# Altium project DXES-101B.PrjPcb
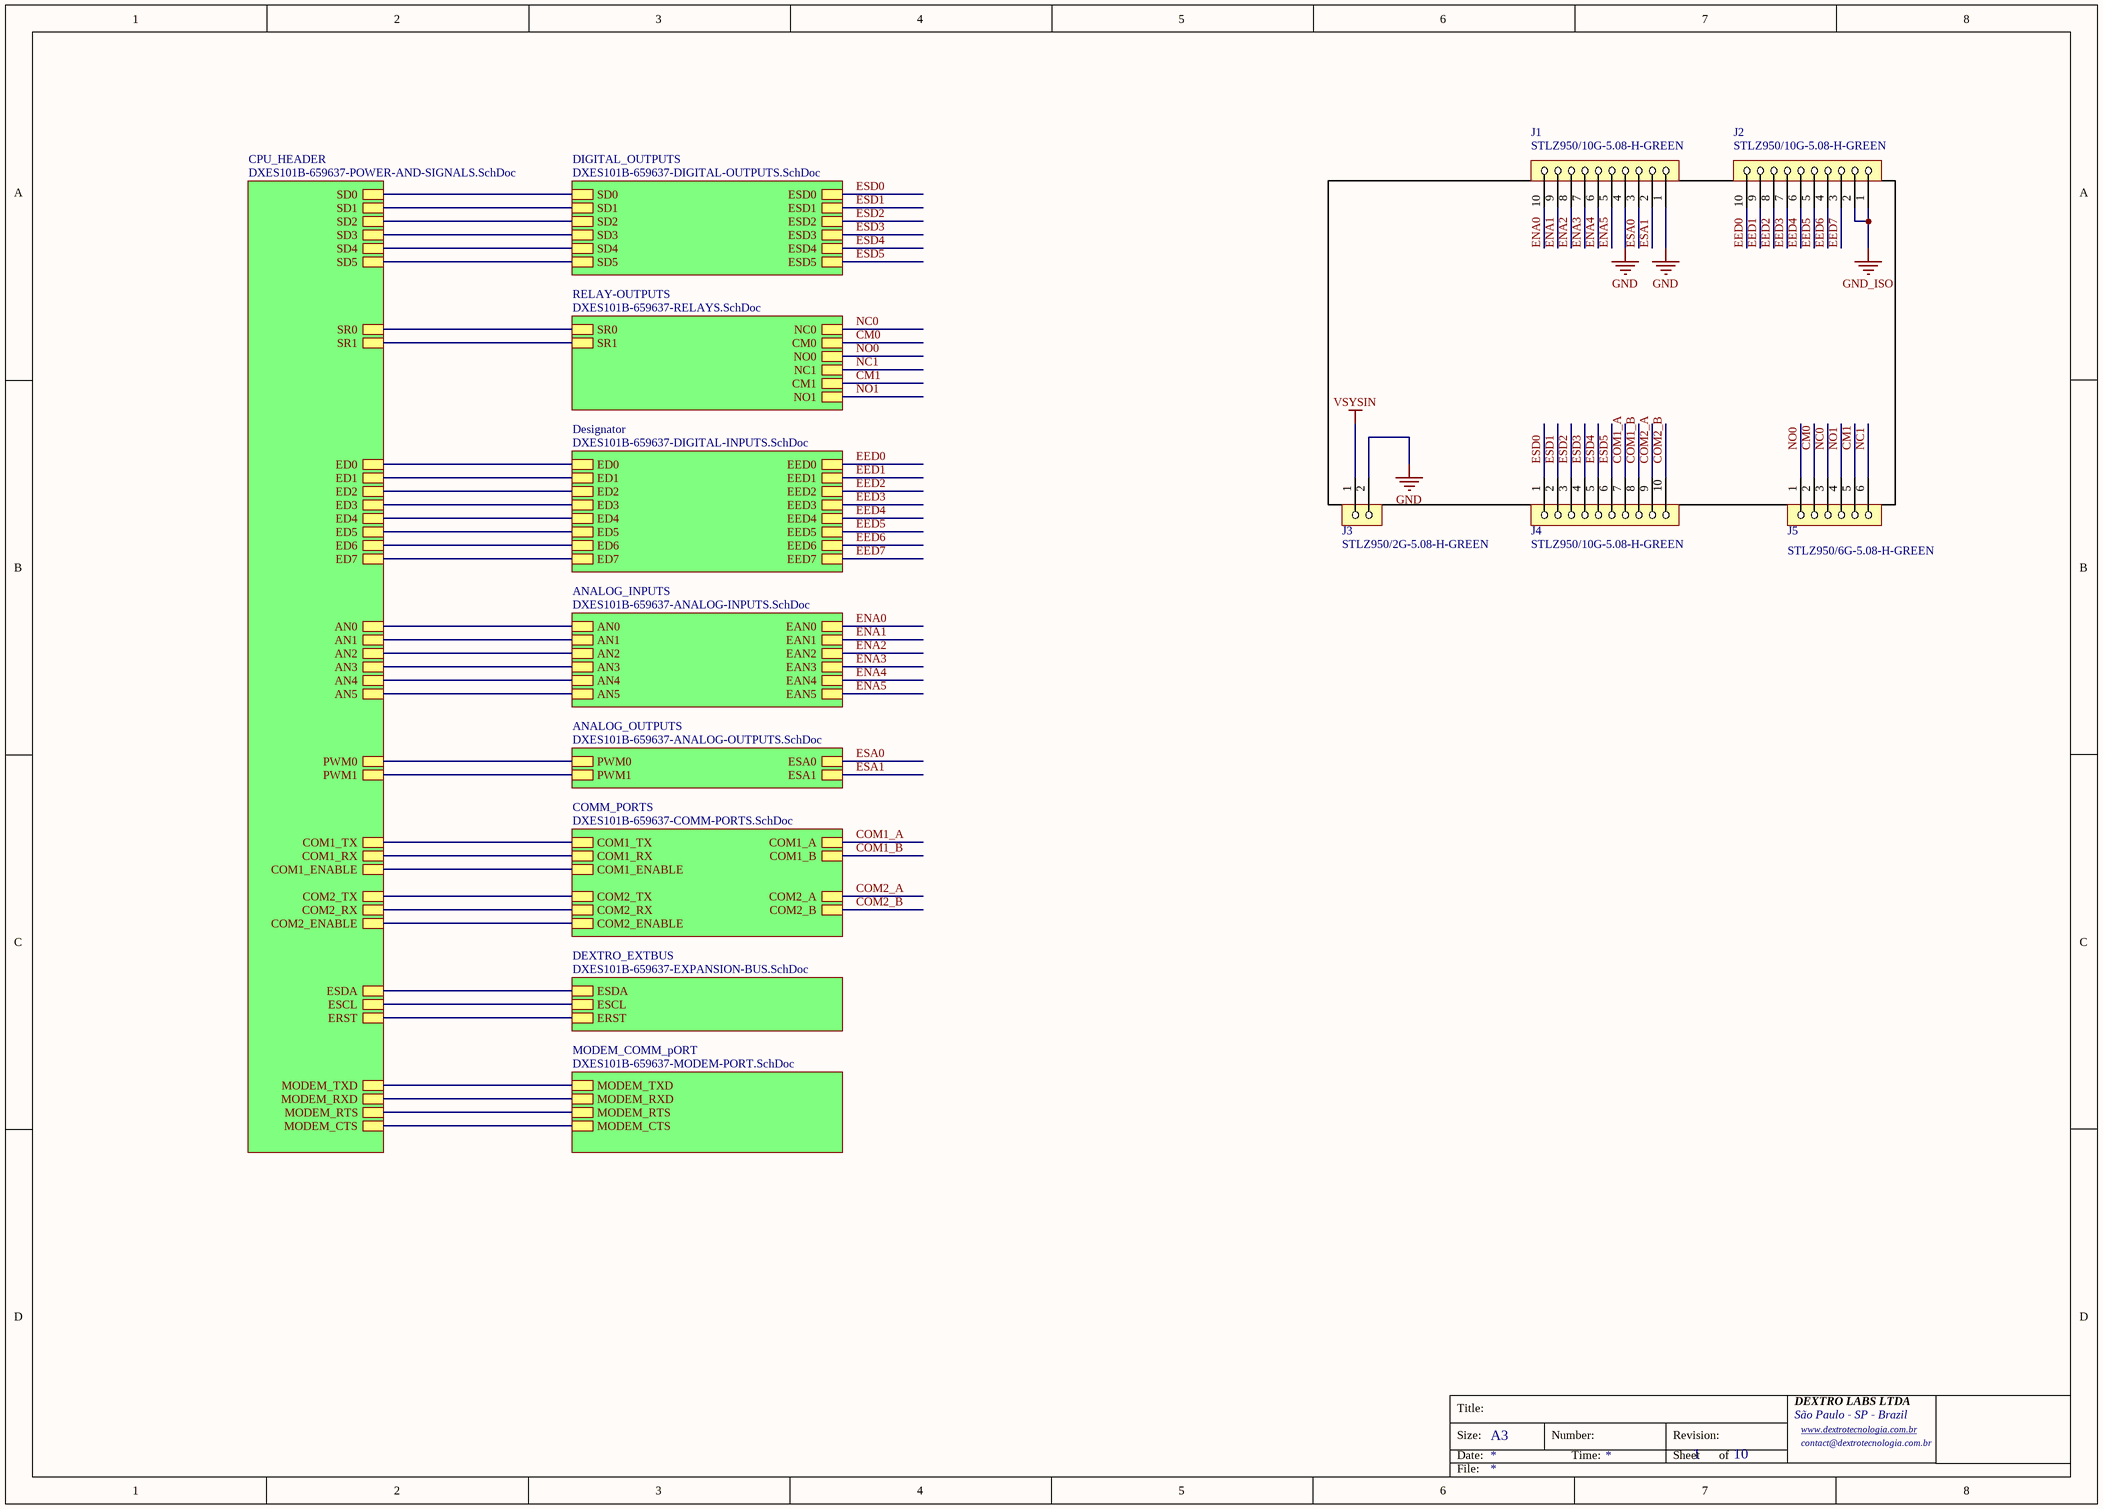
[diagram p0: DXES101B-659637-GENERAL.SchDoc]
10 sheets, 290 parts. Net scope: hierarchical (ports join the sheet entries above them; power ports are global).
Board file: DXES101B-659637.PcbDoc
Sheets:
  DXES101B-659637-GENERAL.SchDoc
    CPU_HEADER = DXES101B-659637-POWER-AND-SIGNALS.SchDoc
    DIGITAL_OUTPUTS = DXES101B-659637-DIGITAL-OUTPUTS.SchDoc
    RELAY-OUTPUTS = DXES101B-659637-RELAYS.SchDoc
    Designator = DXES101B-659637-DIGITAL-INPUTS.SchDoc
    ANALOG_INPUTS = DXES101B-659637-ANALOG-INPUTS.SchDoc
    ANALOG_OUTPUTS = DXES101B-659637-ANALOG-OUTPUTS.SchDoc
    COMM_PORTS = DXES101B-659637-COMM-PORTS.SchDoc
    DEXTRO_EXTBUS = DXES101B-659637-EXPANSION-BUS.SchDoc
    MODEM_COMM_pORT = DXES101B-659637-MODEM-PORT.SchDoc

## Sheet DXES101B-659637-GENERAL.SchDoc
size A3; Organization: Altium Limited; Address1: 3 Minna Close; Address2: Belrose; Address3: NSW 2085; Address4: Australia; SheetNumber: 1; SheetTotal: 10

### Parts
J1  STLZ950/10G-5.08-H-GREEN  [STLZ950-10G-H]
J2  STLZ950/10G-5.08-H-GREEN  [STLZ950-10G-H]
J3  STLZ950/2G-5.08-H-GREEN  [STLZ950-02G-H]
J4  STLZ950/10G-5.08-H-GREEN  [STLZ950-10G-H]
J5  STLZ950/6G-5.08-H-GREEN  [STLZ950-06G-H]

### Sub-sheets
ANALOG_INPUTS = DXES101B-659637-ANALOG-INPUTS.SchDoc: AN0, AN1, AN2, AN3, EAN0, EAN1, EAN2, EAN3, EAN4, EAN5, AN4, AN5
ANALOG_OUTPUTS = DXES101B-659637-ANALOG-OUTPUTS.SchDoc: PWM0, PWM1, ESA0, ESA1
COMM_PORTS = DXES101B-659637-COMM-PORTS.SchDoc: COM1_TX, COM1_RX, COM1_ENABLE, COM2_TX, COM2_RX, COM2_ENABLE, COM1_A, COM1_B, COM2_A, COM2_B
CPU_HEADER = DXES101B-659637-POWER-AND-SIGNALS.SchDoc: SD0, SD1, SD2, SD3, SD4, SD5, SR0, SR1, ED0, ED1, ED2, ED3, ED4, ED5, ED6, ED7, AN0, AN1, AN2, AN3, PWM0, PWM1, COM1_TX, COM1_RX, COM1_ENABLE, COM2_TX, COM2_RX, COM2_ENABLE, ESDA, ESCL, ERST, MODEM_TXD, MODEM_RXD, MODEM_RTS, MODEM_CTS, AN4, AN5
Designator = DXES101B-659637-DIGITAL-INPUTS.SchDoc: ED0, ED1, ED2, ED3, ED4, ED5, ED6, ED7, EED0, EED1, EED2, EED3, EED4, EED6, EED5, EED7
DEXTRO_EXTBUS = DXES101B-659637-EXPANSION-BUS.SchDoc: ESDA, ESCL, ERST
DIGITAL_OUTPUTS = DXES101B-659637-DIGITAL-OUTPUTS.SchDoc: SD0, SD1, SD2, SD3, SD4, SD5, ESD0, ESD1, ESD2, ESD3, ESD4, ESD5
MODEM_COMM_pORT = DXES101B-659637-MODEM-PORT.SchDoc: MODEM_TXD, MODEM_RXD, MODEM_RTS, MODEM_CTS
RELAY-OUTPUTS = DXES101B-659637-RELAYS.SchDoc: SR0, SR1, NC0, CM0, NO0, NC1, CM1, NO1

### Nets
GND: J1.1 J1.4 J3.2
GND_ISO: J2.1 J2.2
VSYSIN: J3.1
CM0: J5.2 ; sheet RELAY-OUTPUTS/CM0
CM1: J5.5 ; sheet RELAY-OUTPUTS/CM1
COM1_A: J4.7 ; sheet COMM_PORTS/COM1_A
COM1_B: J4.8 ; sheet COMM_PORTS/COM1_B
COM2_A: J4.9 ; sheet COMM_PORTS/COM2_A
COM2_B: J4.10 ; sheet COMM_PORTS/COM2_B
CTS: sheet CPU_HEADER/MODEM_CTS, sheet MODEM_COMM_pORT/MODEM_CTS
EED0: J2.10 ; sheet Designator/EED0
EED1: J2.9 ; sheet Designator/EED1
EED2: J2.8 ; sheet Designator/EED2
EED3: J2.7 ; sheet Designator/EED3
EED4: J2.6 ; sheet Designator/EED4
EED5: J2.5 ; sheet Designator/EED5
EED6: J2.4 ; sheet Designator/EED6
EED7: J2.3 ; sheet Designator/EED7
ENA0: J1.10 ; sheet ANALOG_INPUTS/EAN0
ENA1: J1.9 ; sheet ANALOG_INPUTS/EAN1
ENA2: J1.8 ; sheet ANALOG_INPUTS/EAN2
ENA3: J1.7 ; sheet ANALOG_INPUTS/EAN3
ENA4: J1.6 ; sheet ANALOG_INPUTS/EAN4
ENA5: J1.5 ; sheet ANALOG_INPUTS/EAN5
ESA0: J1.3 ; sheet ANALOG_OUTPUTS/ESA0
ESA1: J1.2 ; sheet ANALOG_OUTPUTS/ESA1
ESD0: J4.1 ; sheet DIGITAL_OUTPUTS/ESD0
ESD1: J4.2 ; sheet DIGITAL_OUTPUTS/ESD1
ESD2: J4.3 ; sheet DIGITAL_OUTPUTS/ESD2
ESD3: J4.4 ; sheet DIGITAL_OUTPUTS/ESD3
ESD4: J4.5 ; sheet DIGITAL_OUTPUTS/ESD4
ESD5: J4.6 ; sheet DIGITAL_OUTPUTS/ESD5
NC0: J5.3 ; sheet RELAY-OUTPUTS/NC0
NC1: J5.6 ; sheet RELAY-OUTPUTS/NC1
NO0: J5.1 ; sheet RELAY-OUTPUTS/NO0
NO1: J5.4 ; sheet RELAY-OUTPUTS/NO1
RTS: sheet CPU_HEADER/MODEM_RTS, sheet MODEM_COMM_pORT/MODEM_RTS
RX2: sheet CPU_HEADER/MODEM_RXD, sheet MODEM_COMM_pORT/MODEM_RXD
TX2: sheet CPU_HEADER/MODEM_TXD, sheet MODEM_COMM_pORT/MODEM_TXD
NetC20_2: sheet CPU_HEADER/AN1, sheet ANALOG_INPUTS/AN1
NetC22_2: sheet CPU_HEADER/AN2, sheet ANALOG_INPUTS/AN2
NetC32_2: sheet CPU_HEADER/AN0, sheet ANALOG_INPUTS/AN0
NetC34_2: sheet CPU_HEADER/AN3, sheet ANALOG_INPUTS/AN3
NetC36_2: sheet CPU_HEADER/AN4, sheet ANALOG_INPUTS/AN4
NetC38_2: sheet CPU_HEADER/AN5, sheet ANALOG_INPUTS/AN5
NetJ6_3: sheet CPU_HEADER/ESDA, sheet DEXTRO_EXTBUS/ESDA
NetJ6_4: sheet CPU_HEADER/ESCL, sheet DEXTRO_EXTBUS/ESCL
NetJ6_5: sheet CPU_HEADER/ERST, sheet DEXTRO_EXTBUS/ERST
NetK1_1: sheet CPU_HEADER/ED0, sheet Designator/ED0
NetK1_2: sheet CPU_HEADER/ED1, sheet Designator/ED1
NetK1_3: sheet CPU_HEADER/ED2, sheet Designator/ED2
NetK1_4: sheet CPU_HEADER/ED3, sheet Designator/ED3
NetK1_5: sheet CPU_HEADER/ED4, sheet Designator/ED4
NetK1_6: sheet CPU_HEADER/ED5, sheet Designator/ED5
NetK1_7: sheet CPU_HEADER/ED6, sheet Designator/ED6
NetK1_8: sheet CPU_HEADER/ED7, sheet Designator/ED7
NetK1_15: sheet CPU_HEADER/SR0, sheet RELAY-OUTPUTS/SR0
NetK1_16: sheet CPU_HEADER/SR1, sheet RELAY-OUTPUTS/SR1
NetK2_9: sheet CPU_HEADER/PWM1, sheet ANALOG_OUTPUTS/PWM1
NetK2_10: sheet CPU_HEADER/PWM0, sheet ANALOG_OUTPUTS/PWM0
NetK3_1: sheet CPU_HEADER/COM1_TX, sheet COMM_PORTS/COM1_TX
NetK3_2: sheet CPU_HEADER/COM1_RX, sheet COMM_PORTS/COM1_RX
NetK3_3: sheet CPU_HEADER/COM1_ENABLE, sheet COMM_PORTS/COM1_ENABLE
NetK3_4: sheet CPU_HEADER/COM2_ENABLE, sheet COMM_PORTS/COM2_ENABLE
NetK3_5: sheet CPU_HEADER/COM2_TX, sheet COMM_PORTS/COM2_TX
NetK3_6: sheet CPU_HEADER/COM2_RX, sheet COMM_PORTS/COM2_RX
NetK3_9: sheet CPU_HEADER/SD0, sheet DIGITAL_OUTPUTS/SD0
NetK3_10: sheet CPU_HEADER/SD1, sheet DIGITAL_OUTPUTS/SD1
NetK3_11: sheet CPU_HEADER/SD2, sheet DIGITAL_OUTPUTS/SD2
NetK3_12: sheet CPU_HEADER/SD3, sheet DIGITAL_OUTPUTS/SD3
NetK3_13: sheet CPU_HEADER/SD4, sheet DIGITAL_OUTPUTS/SD4
NetK3_14: sheet CPU_HEADER/SD5, sheet DIGITAL_OUTPUTS/SD5

### Notes on the sheet
- Title:
- Size:
- Date:
- A3
- Number:
- Time:
- Revision:
- Sheet
- of
- DEXTRO LABS LTDA
- São Paulo - SP - Brazil
- www.dextrotecnologia.com.br <http://www.dextrotecnologia.com.br>
- contact@dextrotecnologia.com.br
- File:

### Library data of the parts
J1 J2 J4 = STLZ950/10G-5.08-H-GREEN: CONECTOR PHOENIX MECANO 10 VIAS PASSO 5,08mm VERDE 90º
J3 = STLZ950/2G-5.08-H-GREEN: CONECTOR PHOENIX MECANO 2 VIAS PASSO 5,08mm VERDE 90º
J5 = STLZ950/6G-5.08-H-GREEN: CONECTOR PHOENIX MECANO 6 VIAS PASSO 5,08mm VERDE 90º

## Sheet DXES101B-659637-POWER-AND-SIGNALS.SchDoc
size A3; Organization: Altium Limited; Address1: 3 Minna Close; Address2: Belrose; Address3: NSW 2085; Address4: Australia; SheetNumber: 2; SheetTotal: 10
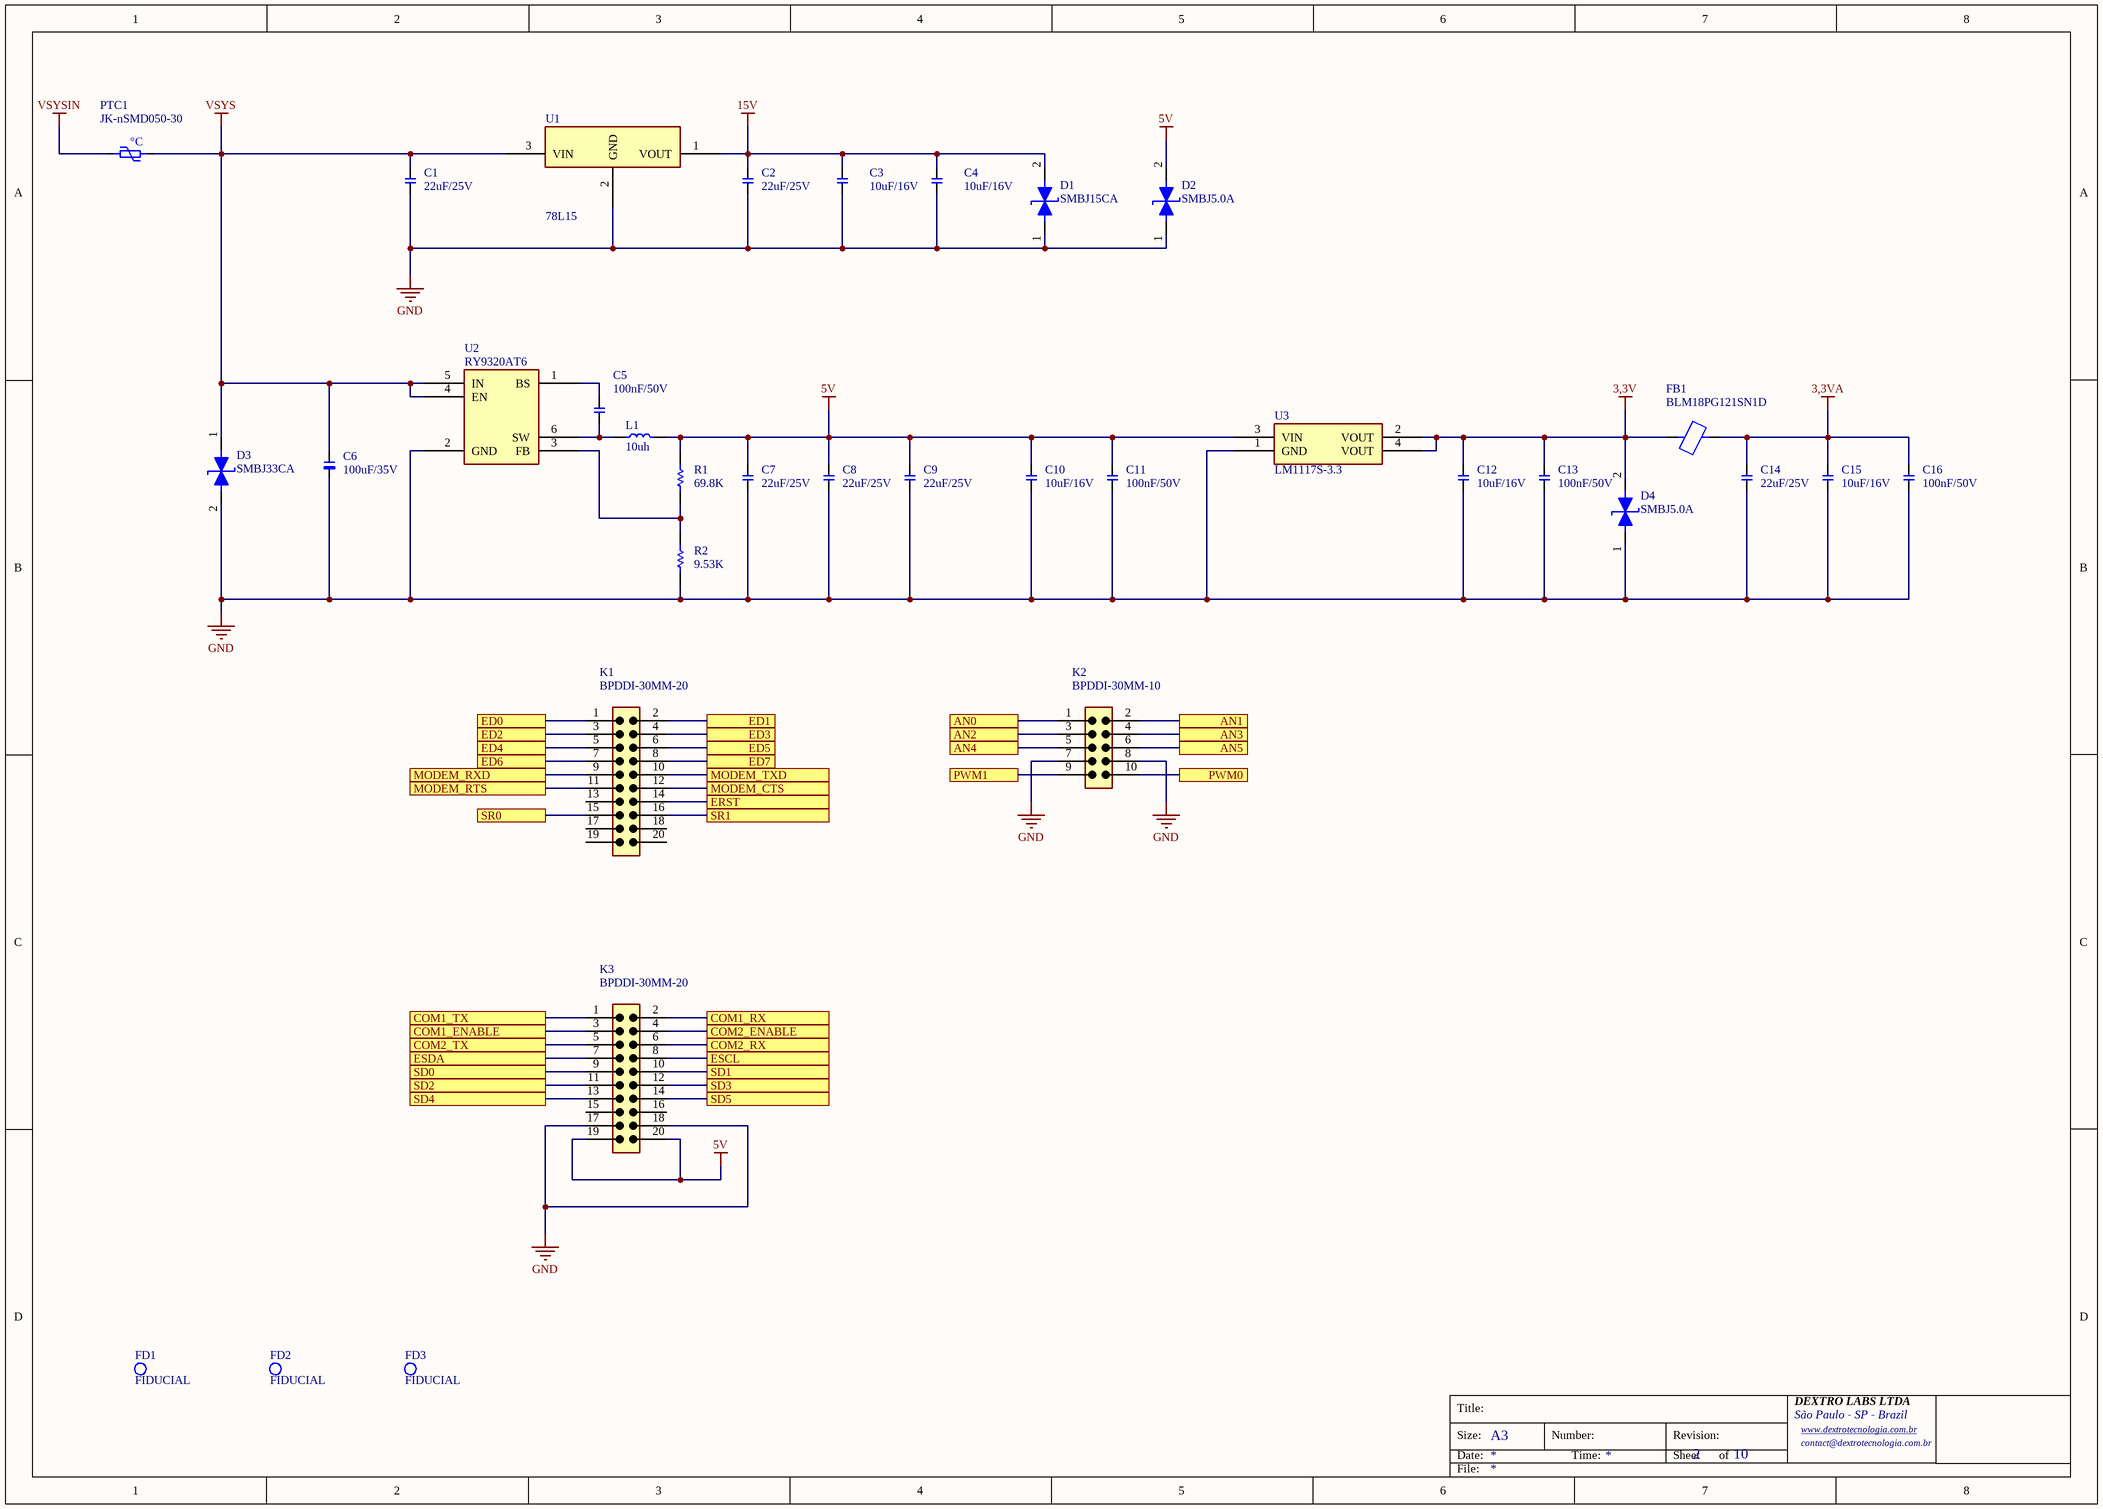
[diagram p1: DXES101B-659637-POWER-AND-SIGNALS.SchDoc]

### Parts
C1  22uF/25V  [CAP-1206]
C2  22uF/25V  [CAP-1206]
C3  10uF/16V  [CAP-0603]
C4  10uF/16V  [CAP-0603]
C5  100nF/50V  [CAP-0603]
C6  100uF/35V  [CAP-TH_BD6.3-P2.50-D1.0-FD]
C7  22uF/25V  [CAP-1206]
C8  22uF/25V  [CAP-1206]
C9  22uF/25V  [CAP-1206]
C10  10uF/16V  [CAP-0603]
C11  100nF/50V  [CAP-0603]
C12  10uF/16V  [CAP-0603]
C13  100nF/50V  [CAP-0603]
C14  22uF/25V  [CAP-1206]
C15  10uF/16V  [CAP-0603]
C16  100nF/50V  [CAP-0603]
D1  SMBJ15CA  [DO214-AA]
D2  SMBJ5.0A  [DO214-AA]
D3  SMBJ33CA  [DO214-AA]
D4  SMBJ5.0A  [DO214-AA]
FB1  BLM18PG121SN1D  [RES-0603]
FD1  FIDUCIAL  [FIDUCIAL]
FD2  FIDUCIAL  [FIDUCIAL]
FD3  FIDUCIAL  [FIDUCIAL]
K1  BPDDI-30MM-20  [BPDDI-30MM-20]
K2  BPDDI-30MM-10  [BPDDI-30MM-10]
K3  BPDDI-30MM-20  [BPDDI-30MM-20]
L1  10uh  [IND-SMD_2P-L5.0-W5.0]
PTC1  JK-nSMD050-30  [PTC-1206]
R1  69.8K  [RES-0603]
R2  9.53K  [RES-0603]
U1  78L15  [SOT-89-3_L4.5-W2.5-P1.50-LS4.1-BR]
U2  RY9320AT6  [SOT23-6]
U3  LM1117S-3.3  [SOT-223-3_L6.7-W3.7-P2.30-LS7.0-BR_2]

### Ports
AN0 (see DXES101B-659637-GENERAL[2B], DXES101B-659637-ANALOG-INPUTS[4A]), AN1 (see DXES101B-659637-GENERAL[2B], DXES101B-659637-ANALOG-INPUTS[8A]), AN2 (see DXES101B-659637-GENERAL[2B], DXES101B-659637-ANALOG-INPUTS[4B]), AN3 (see DXES101B-659637-GENERAL[2B], DXES101B-659637-ANALOG-INPUTS[8B]), AN4 (see DXES101B-659637-GENERAL[2B], DXES101B-659637-ANALOG-INPUTS[4C]), AN5 (see DXES101B-659637-GENERAL[2B], DXES101B-659637-ANALOG-INPUTS[8C]), COM1_ENABLE (see DXES101B-659637-GENERAL[2C], DXES101B-659637-COMM-PORTS[3A]), COM1_RX (see DXES101B-659637-GENERAL[2C], DXES101B-659637-COMM-PORTS[3A]), COM1_TX (see DXES101B-659637-GENERAL[2C], DXES101B-659637-COMM-PORTS[3A]), COM2_ENABLE (see DXES101B-659637-GENERAL[2C], DXES101B-659637-COMM-PORTS[3B]), COM2_RX (see DXES101B-659637-GENERAL[2C], DXES101B-659637-COMM-PORTS[3B]), COM2_TX (see DXES101B-659637-GENERAL[2C], DXES101B-659637-COMM-PORTS[3B]), ED0 (see DXES101B-659637-GENERAL[2B], DXES101B-659637-DIGITAL-INPUTS[4A]), ED1 (see DXES101B-659637-GENERAL[2B], DXES101B-659637-DIGITAL-INPUTS[7A]), ED2 (see DXES101B-659637-GENERAL[2B], DXES101B-659637-DIGITAL-INPUTS[4B]), ED3 (see DXES101B-659637-GENERAL[2B], DXES101B-659637-DIGITAL-INPUTS[7B]), ED4 (see DXES101B-659637-GENERAL[2B], DXES101B-659637-DIGITAL-INPUTS[4B]), ED5 (see DXES101B-659637-GENERAL[2B], DXES101B-659637-DIGITAL-INPUTS[7B]), ED6 (see DXES101B-659637-GENERAL[2B], DXES101B-659637-DIGITAL-INPUTS[4C]), ED7 (see DXES101B-659637-GENERAL[2B], DXES101B-659637-DIGITAL-INPUTS[7C]), ERST (see DXES101B-659637-GENERAL[2C], DXES101B-659637-EXPANSION-BUS[4B]), ESCL (see DXES101B-659637-GENERAL[2C], DXES101B-659637-EXPANSION-BUS[4B]), ESDA (see DXES101B-659637-GENERAL[2C], DXES101B-659637-EXPANSION-BUS[4B]), MODEM_CTS (see DXES101B-659637-GENERAL[2C], DXES101B-659637-MODEM-PORT[4B]), MODEM_RTS (see DXES101B-659637-GENERAL[2C], DXES101B-659637-MODEM-PORT[4B]), MODEM_RXD (see DXES101B-659637-GENERAL[2C], DXES101B-659637-MODEM-PORT[4B]), MODEM_TXD (see DXES101B-659637-GENERAL[2C], DXES101B-659637-MODEM-PORT[4B]), PWM0 (see DXES101B-659637-GENERAL[2C], DXES101B-659637-ANALOG-OUTPUTS[2A]), PWM1 (see DXES101B-659637-GENERAL[2C], DXES101B-659637-ANALOG-OUTPUTS[2C]), SD0 (see DXES101B-659637-GENERAL[2A], DXES101B-659637-DIGITAL-OUTPUTS[1B]), SD1 (see DXES101B-659637-GENERAL[2A], DXES101B-659637-DIGITAL-OUTPUTS[3B]), SD2 (see DXES101B-659637-GENERAL[2A], DXES101B-659637-DIGITAL-OUTPUTS[6B]), SD3 (see DXES101B-659637-GENERAL[2A], DXES101B-659637-DIGITAL-OUTPUTS[1C]), SD4 (see DXES101B-659637-GENERAL[2A], DXES101B-659637-DIGITAL-OUTPUTS[3C]), SD5 (see DXES101B-659637-GENERAL[2A], DXES101B-659637-DIGITAL-OUTPUTS[6C]), SR0 (see DXES101B-659637-GENERAL[2A], DXES101B-659637-RELAYS[3B]), SR1 (see DXES101B-659637-GENERAL[2A], DXES101B-659637-RELAYS[3C])

### Nets
3,3V: C12.2 C13.2 D4.2(A2) FB1.1 U3.2(VOUT) U3.4(VOUT)
3,3VA: C14.2 C15.2 C16.2 FB1.2
5V: C7.2 C8.2 C9.2 C10.2 C11.2 D2.2(A2) K3.19 K3.20 L1.2 R1.2 U3.3(VIN)
15V: C2.2 C3.2 C4.2 D1.2(A2) U1.1(VOUT)
GND: C1.1 C2.1 C3.1 C4.1 C6.2 C7.1 C8.1 C9.1 C10.1 C11.1 C12.1 C13.1 C14.1 C15.1 C16.1 D1.1(A1) D2.1(A1) D3.2(A1) D4.1(A1) K2.7 K2.8 K3.17 K3.18 R2.1 U1.2(GND) U2.2(GND) U3.1(GND)
VSYS: C1.2 C6.1 D3.1(A2) PTC1.2 U1.3(VIN) U2.4(EN) U2.5(IN)
VSYSIN: PTC1.1
CTS: K1.12 ; port MODEM_CTS
RTS: K1.11 ; port MODEM_RTS
RX2: K1.9 ; port MODEM_RXD
TX2: K1.10 ; port MODEM_TXD
NetC5_1: C5.1 L1.1 U2.6(SW)
NetC5_2: C5.2 U2.1(BS)
NetC20_2: K2.2 ; port AN1
NetC22_2: K2.3 ; port AN2
NetC32_2: K2.1 ; port AN0
NetC34_2: K2.4 ; port AN3
NetC36_2: K2.5 ; port AN4
NetC38_2: K2.6 ; port AN5
NetJ6_3: K3.7 ; port ESDA
NetJ6_4: K3.8 ; port ESCL
NetJ6_5: K1.14 ; port ERST
NetK1_1: K1.1 ; port ED0
NetK1_2: K1.2 ; port ED1
NetK1_3: K1.3 ; port ED2
NetK1_4: K1.4 ; port ED3
NetK1_5: K1.5 ; port ED4
NetK1_6: K1.6 ; port ED5
NetK1_7: K1.7 ; port ED6
NetK1_8: K1.8 ; port ED7
NetK1_15: K1.15 ; port SR0
NetK1_16: K1.16 ; port SR1
NetK2_9: K2.9 ; port PWM1
NetK2_10: K2.10 ; port PWM0
NetK3_1: K3.1 ; port COM1_TX
NetK3_2: K3.2 ; port COM1_RX
NetK3_3: K3.3 ; port COM1_ENABLE
NetK3_4: K3.4 ; port COM2_ENABLE
NetK3_5: K3.5 ; port COM2_TX
NetK3_6: K3.6 ; port COM2_RX
NetK3_9: K3.9 ; port SD0
NetK3_10: K3.10 ; port SD1
NetK3_11: K3.11 ; port SD2
NetK3_12: K3.12 ; port SD3
NetK3_13: K3.13 ; port SD4
NetK3_14: K3.14 ; port SD5
NetR1_1: R1.1 R2.2 U2.3(FB)

Not connected (* = marked no-connect by the designer): K1 13 17 18 19 20; K3 15 16

### Notes on the sheet
- Title:
- Size:
- Date:
- A3
- Number:
- Time:
- Revision:
- Sheet
- of
- DEXTRO LABS LTDA
- São Paulo - SP - Brazil
- www.dextrotecnologia.com.br <http://www.dextrotecnologia.com.br>
- contact@dextrotecnologia.com.br
- File:
- (in symbol PTC-FUSE-30V-500mA-1206) °C

### Library data of the parts
C1 C2 C7-C9 C14 = CAP-22uF/25V-1206-X5R-MLCC: 25V 22uF X5R ±10% 1206 Multilayer Ceramic Capacitors MLCC - SMD/SMT ROHS; LCSC: C12891
C3 C4 C10 C12 C15 = CAP-10uF/16V-0603-X5R: 16V 10uF X5R ±20% 0603 Multilayer Ceramic Capacitors MLCC - SMD/SMT ROHS; LCSC: C92487
C5 C11 C13 C16 = CAP-100nF/50V-0603-X7R-MLCC: 50V 100nF X7R ±10% 0603 Multilayer Ceramic Capacitors MLCC - SMD/SMT ROHS; LCSC: C14663
C6 = CAP-100uF/35V-ELET-D10xL20mm_1: 100uF 35V Aluminum Electrolytic Capacitors Through Hole,D6.3xL11mm 2000hrs@105℃; LCSC: C109392
D1 = SMBJ15CA: 24.6A 600W@8/20us 24.4V 19.2V Bidirectional 15V SMB(DO-214AA) ESD and Surge Protection (TVS/ESD) ROHS; LCSC: C2760879
D2 D4 = SMBJ5.0A: 65.3A 600W 9.2V 6.4V Unidirectional 5V DO-214AA ESD and Surge Protection (TVS/ESD) ROHS; LCSC: C83333
D3 = SMBJ33CA: A 600W@8/20us 24.4V 33V Bidirectional 15V SMB(DO-214AA) ESD and Surge Protection (TVS/ESD) ROHS; LCSC: C3001986
FB1 = BLM18PG121SN1D: FERRITE BEAD 120Ω 0603 1LN; LCSC: C14709
K1 K3 = BPDDI-30MM-20: BARRA DE PINOS DUPLA 2,54mm 20 VIAS 180º DUPLO ISOLADOR PINO 30mm
K2 = BPDDI-30MM-10: BARRA DE PINOS DUPLA 2,54mm 10 VIAS 180º DUPLO ISOLADOR PINO 30mm
L1 = FIXED-INDUCTOR-SMD-10uH-5X5mm-2A-15mΩ_1: 2A 10uH ±20% Magnetic Shielded Inductor 2A SMD,5x5mm Fixed Inductors RoHS; LCSC: C9389
PTC1 = PTC-FUSE-30V-500mA-1206: 30V 500mA 100A 1A 150mΩ 1206 PTC Resettable Fuses ROHS; LCSC: C720075
R1 = RES-69.8K-1%-100mW-0603_1: 100mW Thick Film Resistor 75V ±100ppm/℃ ±1% 69.8K 0603 Chip Resistor - Surface Mount ROHS; LCSC: C2907025
R2 = RES-9.53K-1%-100mW-0603: 100mW Thick Film Resistor 75V ±100ppm/℃ ±1% 9.53K 0603 Chip Resistor - Surface Mount ROHS; LCSC: C23127
U1 = 78L15: 3-Terminal Positive Voltage Regulator - SOT89; LCSC: C5309538
U2 = RY9320AT6: 500kHz Buck Adjustable 2A SOT-23-6 Voltage Regulators - DC DC Switching Regulators RoHS; LCSCC: C2962442
U3 = LM1117S-3.3: LCSC: C126027

## Sheet DXES101B-659637-DIGITAL-OUTPUTS.SchDoc: DXES100
size A3; Organization: Altium Limited; Address1: 3 Minna Close; Address2: Belrose; Address3: NSW 2085; Address4: Australia; SheetNumber: 3; SheetTotal: 10
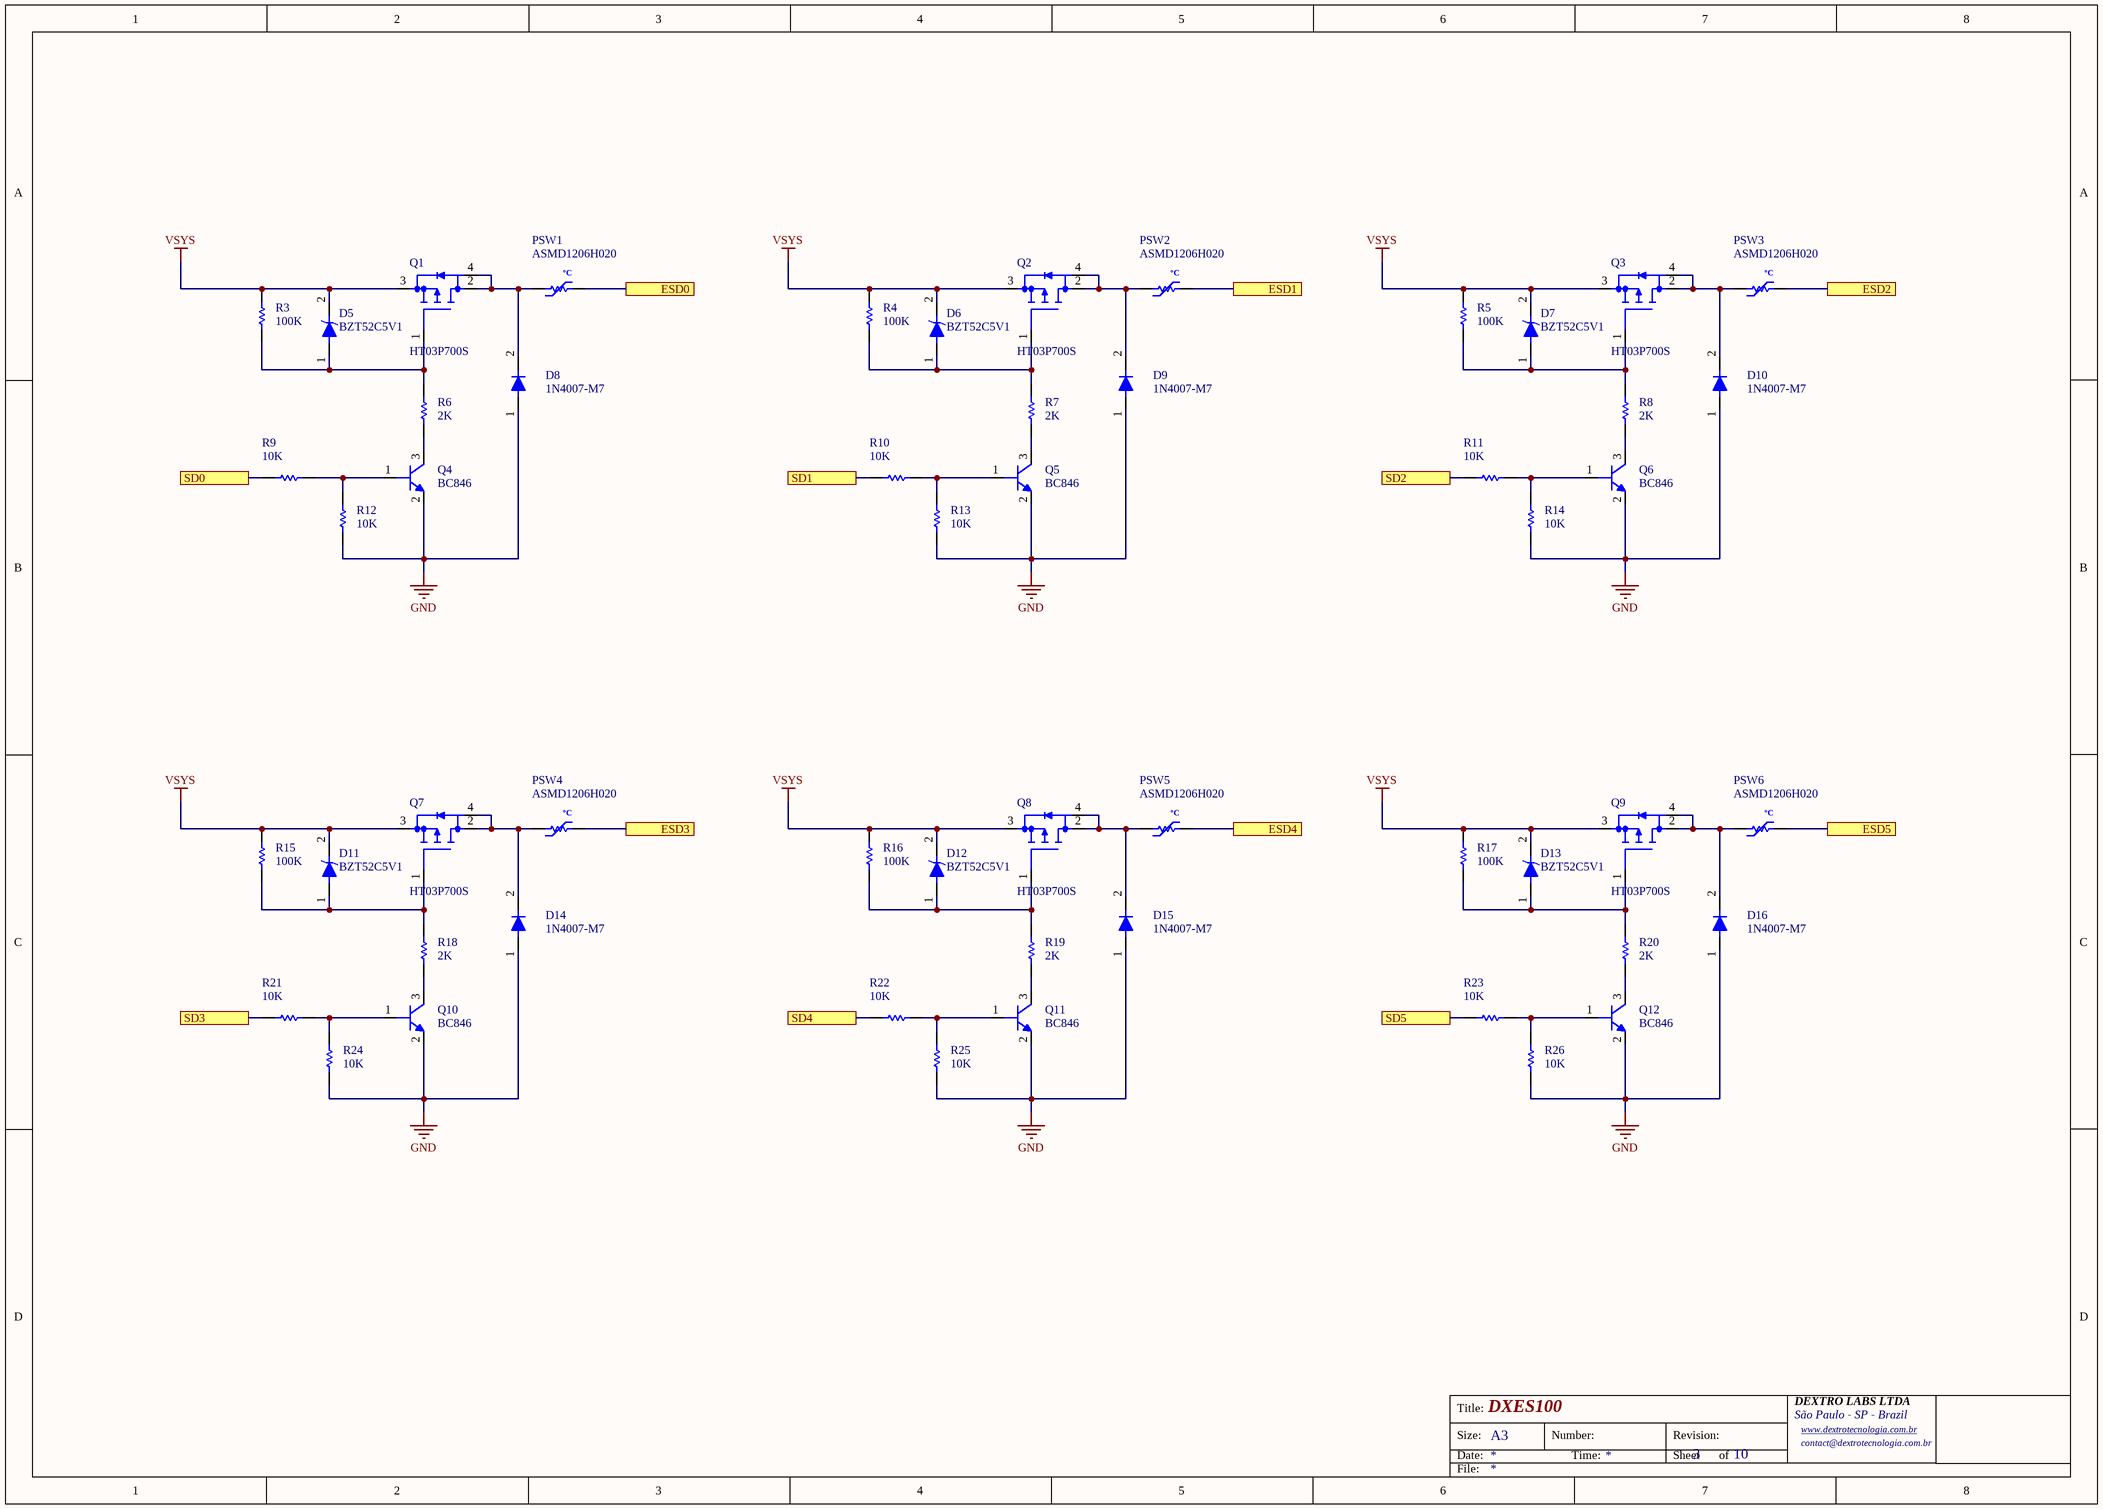
[diagram p2: DXES101B-659637-DIGITAL-OUTPUTS.SchDoc]

### Parts
D5  BZT52C5V1  [SOD123]
D6  BZT52C5V1  [SOD123]
D7  BZT52C5V1  [SOD123]
D8  1N4007-M7  [SMA]
D9  1N4007-M7  [SMA]
D10  1N4007-M7  [SMA]
D11  BZT52C5V1  [SOD123]
D12  BZT52C5V1  [SOD123]
D13  BZT52C5V1  [SOD123]
D14  1N4007-M7  [SMA]
D15  1N4007-M7  [SMA]
D16  1N4007-M7  [SMA]
PSW1  ASMD1206H020  [PTC-1206]
PSW2  ASMD1206H020  [PTC-1206]
PSW3  ASMD1206H020  [PTC-1206]
PSW4  ASMD1206H020  [PTC-1206]
PSW5  ASMD1206H020  [PTC-1206]
PSW6  ASMD1206H020  [PTC-1206]
Q1  HT03P700S  [SOT-223-3_L6.7-W3.7-P2.30-LS7.0-BR_2]
Q2  HT03P700S  [SOT-223-3_L6.7-W3.7-P2.30-LS7.0-BR_2]
Q3  HT03P700S  [SOT-223-3_L6.7-W3.7-P2.30-LS7.0-BR_2]
Q4  BC846  [SOT23-3]
Q5  BC846  [SOT23-3]
Q6  BC846  [SOT23-3]
Q7  HT03P700S  [SOT-223-3_L6.7-W3.7-P2.30-LS7.0-BR_2]
Q8  HT03P700S  [SOT-223-3_L6.7-W3.7-P2.30-LS7.0-BR_2]
Q9  HT03P700S  [SOT-223-3_L6.7-W3.7-P2.30-LS7.0-BR_2]
Q10  BC846  [SOT23-3]
Q11  BC846  [SOT23-3]
Q12  BC846  [SOT23-3]
R3  100K  [RES-0603]
R4  100K  [RES-0603]
R5  100K  [RES-0603]
R6  2K  [RES-1206]
R7  2K  [RES-1206]
R8  2K  [RES-1206]
R9  10K  [RES-0603]
R10  10K  [RES-0603]
R11  10K  [RES-0603]
R12  10K  [RES-0603]
R13  10K  [RES-0603]
R14  10K  [RES-0603]
R15  100K  [RES-0603]
R16  100K  [RES-0603]
R17  100K  [RES-0603]
R18  2K  [RES-1206]
R19  2K  [RES-1206]
R20  2K  [RES-1206]
R21  10K  [RES-0603]
R22  10K  [RES-0603]
R23  10K  [RES-0603]
R24  10K  [RES-0603]
R25  10K  [RES-0603]
R26  10K  [RES-0603]

### Ports
ESD0 (see DXES101B-659637-GENERAL[4A]), ESD1 (see DXES101B-659637-GENERAL[4A]), ESD2 (see DXES101B-659637-GENERAL[4A]), ESD3 (see DXES101B-659637-GENERAL[4A]), ESD4 (see DXES101B-659637-GENERAL[4A]), ESD5 (see DXES101B-659637-GENERAL[4A]), SD0 (see DXES101B-659637-GENERAL[3A], DXES101B-659637-POWER-AND-SIGNALS[2C]), SD1 (see DXES101B-659637-GENERAL[3A], DXES101B-659637-POWER-AND-SIGNALS[3C]), SD2 (see DXES101B-659637-GENERAL[3A], DXES101B-659637-POWER-AND-SIGNALS[2C]), SD3 (see DXES101B-659637-GENERAL[3A], DXES101B-659637-POWER-AND-SIGNALS[3C]), SD4 (see DXES101B-659637-GENERAL[3A], DXES101B-659637-POWER-AND-SIGNALS[2C]), SD5 (see DXES101B-659637-GENERAL[3A], DXES101B-659637-POWER-AND-SIGNALS[3C])

### Nets
GND: D8.1(A1) D9.1(A1) D10.1(A1) D14.1(A1) D15.1(A1) D16.1(A1) Q4.2 Q5.2 Q6.2 Q10.2 Q11.2 Q12.2 R12.1 R13.1 R14.1 R24.1 R25.1 R26.1
VSYS: D5.2(K) D6.2(K) D7.2(K) D11.2(K) D12.2(K) D13.2(K) Q1.3(S) Q2.3(S) Q3.3(S) Q7.3(S) Q8.3(S) Q9.3(S) R3.2 R4.2 R5.2 R15.2 R16.2 R17.2
ESD0: PSW1.2 ; port ESD0
ESD1: PSW2.2 ; port ESD1
ESD2: PSW3.2 ; port ESD2
ESD3: PSW4.2 ; port ESD3
ESD4: PSW5.2 ; port ESD4
ESD5: PSW6.2 ; port ESD5
NetD5_1: D5.1(A1) Q1.1(G]) R3.1 R6.2
NetD6_1: D6.1(A1) Q2.1(G]) R4.1 R7.2
NetD7_1: D7.1(A1) Q3.1(G]) R5.1 R8.2
NetD8_2: D8.2(K) PSW1.1 Q1.2(D) Q1.4(D)
NetD9_2: D9.2(K) PSW2.1 Q2.2(D) Q2.4(D)
NetD10_2: D10.2(K) PSW3.1 Q3.2(D) Q3.4(D)
NetD11_1: D11.1(A1) Q7.1(G]) R15.1 R18.2
NetD12_1: D12.1(A1) Q8.1(G]) R16.1 R19.2
NetD13_1: D13.1(A1) Q9.1(G]) R17.1 R20.2
NetD14_2: D14.2(K) PSW4.1 Q7.2(D) Q7.4(D)
NetD15_2: D15.2(K) PSW5.1 Q8.2(D) Q8.4(D)
NetD16_2: D16.2(K) PSW6.1 Q9.2(D) Q9.4(D)
NetK3_9: R9.2 ; port SD0
NetK3_10: R10.2 ; port SD1
NetK3_11: R11.2 ; port SD2
NetK3_12: R21.2 ; port SD3
NetK3_13: R22.2 ; port SD4
NetK3_14: R23.2 ; port SD5
NetQ4_1: Q4.1 R9.1 R12.2
NetQ4_3: Q4.3 R6.1
NetQ5_1: Q5.1 R10.1 R13.2
NetQ5_3: Q5.3 R7.1
NetQ6_1: Q6.1 R11.1 R14.2
NetQ6_3: Q6.3 R8.1
NetQ10_1: Q10.1 R21.1 R24.2
NetQ10_3: Q10.3 R18.1
NetQ11_1: Q11.1 R22.1 R25.2
NetQ11_3: Q11.3 R19.1
NetQ12_1: Q12.1 R23.1 R26.2
NetQ12_3: Q12.3 R20.1

### Notes on the sheet
- Title:
- Size:
- Date:
- A3
- Number:
- Time:
- Revision:
- Sheet
- of
- DEXTRO LABS LTDA
- São Paulo - SP - Brazil
- www.dextrotecnologia.com.br <http://www.dextrotecnologia.com.br>
- contact@dextrotecnologia.com.br
- File:
- (in symbol ASMD1206H020) ºC

### Library data of the parts
D5-D7 D11-D13 = BZT52C5V1: DIODE-ZENER-5V1-500mV
D8-D10 D14-D16 = 1N4007-M7: C20754788; LCSC: C20754788
PSW1-PSW6 = ASMD1206H020: PTC RESET FUSE 30V 200mA 1206
Q1-Q3 Q7-Q9 = HT03P700S: MOSFET P-CH 30V 6A SOT-223; LCSC: C49066900
Q4-Q6 Q10-Q12 = TRANSISTOR-BC846B,215-SOT23: 65V 200@10mA,5V 250mW 100mA NPN SOT-23 Bipolar (BJT) ROHS; LCSC: C87062
R3-R5 R15-R17 = RES-100K-1%-100mW-0603: 100mW Thick Film Resistor 75V ±100ppm/℃ ±1% 100kΩ 0603 Chip Resistor - Surface Mount ROHS; LCSC: C14675
R6-R8 R18-R20 = RES-2K-1%-250mW-1206: 250mW Thick Film Resistor 200V ±100ppm/℃ ±5% 2kΩ 1206 Chip Resistor - Surface Mount ROHS; LCSC: C2907466
R9-R14 R21-R26 = RES-10K-1%-100mW-0603: 100mW Thick Film Resistor 75V ±100ppm/℃ ±1% 10kΩ 0603 Chip Resistor - Surface Mount ROHS; LCSC: C98220

## Sheet DXES101B-659637-RELAYS.SchDoc
size A3; Organization: Altium Limited; Address1: 3 Minna Close; Address2: Belrose; Address3: NSW 2085; Address4: Australia; SheetNumber: 4; SheetTotal: 10
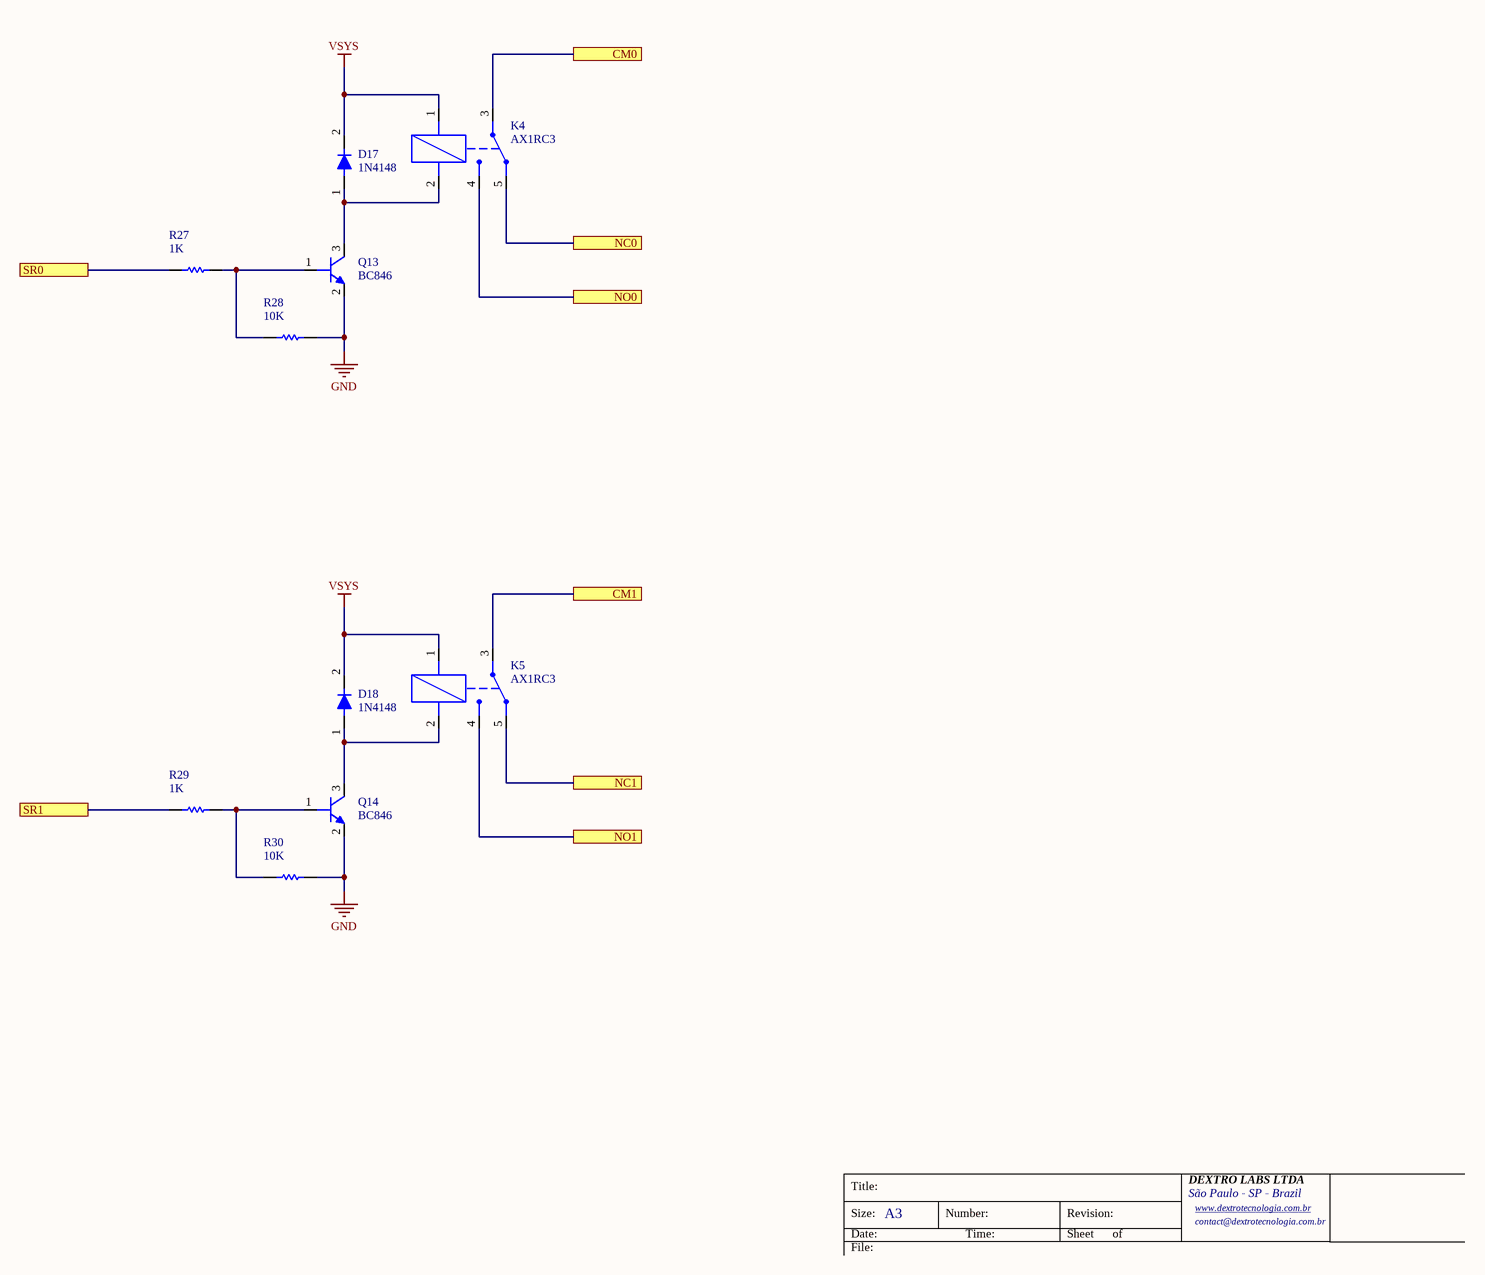
[diagram p3: DXES101B-659637-RELAYS.SchDoc]

### Parts
D17  1N4148  [SOD123]
D18  1N4148  [SOD123]
K4  AX1RC3  [AX1RCX]
K5  AX1RC3  [AX1RCX]
Q13  BC846  [SOT23-3]
Q14  BC846  [SOT23-3]
R27  1K  [RES-0603]
R28  10K  [RES-0603]
R29  1K  [RES-0603]
R30  10K  [RES-0603]

### Ports
CM0 (see DXES101B-659637-GENERAL[4A]), CM1 (see DXES101B-659637-GENERAL[4B]), NC0 (see DXES101B-659637-GENERAL[4A]), NC1 (see DXES101B-659637-GENERAL[4A]), NO0 (see DXES101B-659637-GENERAL[4A]), NO1 (see DXES101B-659637-GENERAL[4B]), SR0 (see DXES101B-659637-GENERAL[3A], DXES101B-659637-POWER-AND-SIGNALS[2C]), SR1 (see DXES101B-659637-GENERAL[3A], DXES101B-659637-POWER-AND-SIGNALS[3C])

### Nets
GND: Q13.2 Q14.2 R28.2 R30.2
VSYS: D17.2(K) D18.2(K) K4.1 K5.1
CM0: K4.3 ; port CM0
CM1: K5.3 ; port CM1
NC0: K4.5 ; port NC0
NC1: K5.5 ; port NC1
NO0: K4.4 ; port NO0
NO1: K5.4 ; port NO1
NetD17_1: D17.1(A1) K4.2 Q13.3
NetD18_1: D18.1(A1) K5.2 Q14.3
NetK1_15: R27.1 ; port SR0
NetK1_16: R29.1 ; port SR1
NetQ13_1: Q13.1 R27.2 R28.1
NetQ14_1: Q14.1 R29.2 R30.1

### Notes on the sheet
- Title:
- Size:
- Date:
- A3
- Number:
- Time:
- Revision:
- Sheet
- of
- DEXTRO LABS LTDA
- São Paulo - SP - Brazil
- www.dextrotecnologia.com.br <http://www.dextrotecnologia.com.br>
- contact@dextrotecnologia.com.br
- File:

### Library data of the parts
D17 D18 = 1N4148: 1A 4ns 75V Independent 1V@50mA 150mA SOD-123 Single Diodes RoHS
K4 K5 = AX1RC3: RELÉ-METALTEX-BOBINA 24V-15A-SPDT
Q13 Q14 = TRANSISTOR-BC846B,215-SOT23: as Q4 on sheet DXES101B-659637-DIGITAL-OUTPUTS; LCSC: C87062
R27 R29 = RES-1K-1%-100mW-0603: 100mW Thick Film Resistor 75V ±100ppm/℃ ±1% 1kΩ 0603 Chip Resistor - Surface Mount ROHS; LCSC: C22548
R28 R30 = RES-10K-1%-100mW-0603: as R9 on sheet DXES101B-659637-DIGITAL-OUTPUTS; LCSC: C98220

## Sheet DXES101B-659637-DIGITAL-INPUTS.SchDoc
size A3; Organization: Altium Limited; Address1: 3 Minna Close; Address2: Belrose; Address3: NSW 2085; Address4: Australia; SheetNumber: 5; SheetTotal: 10
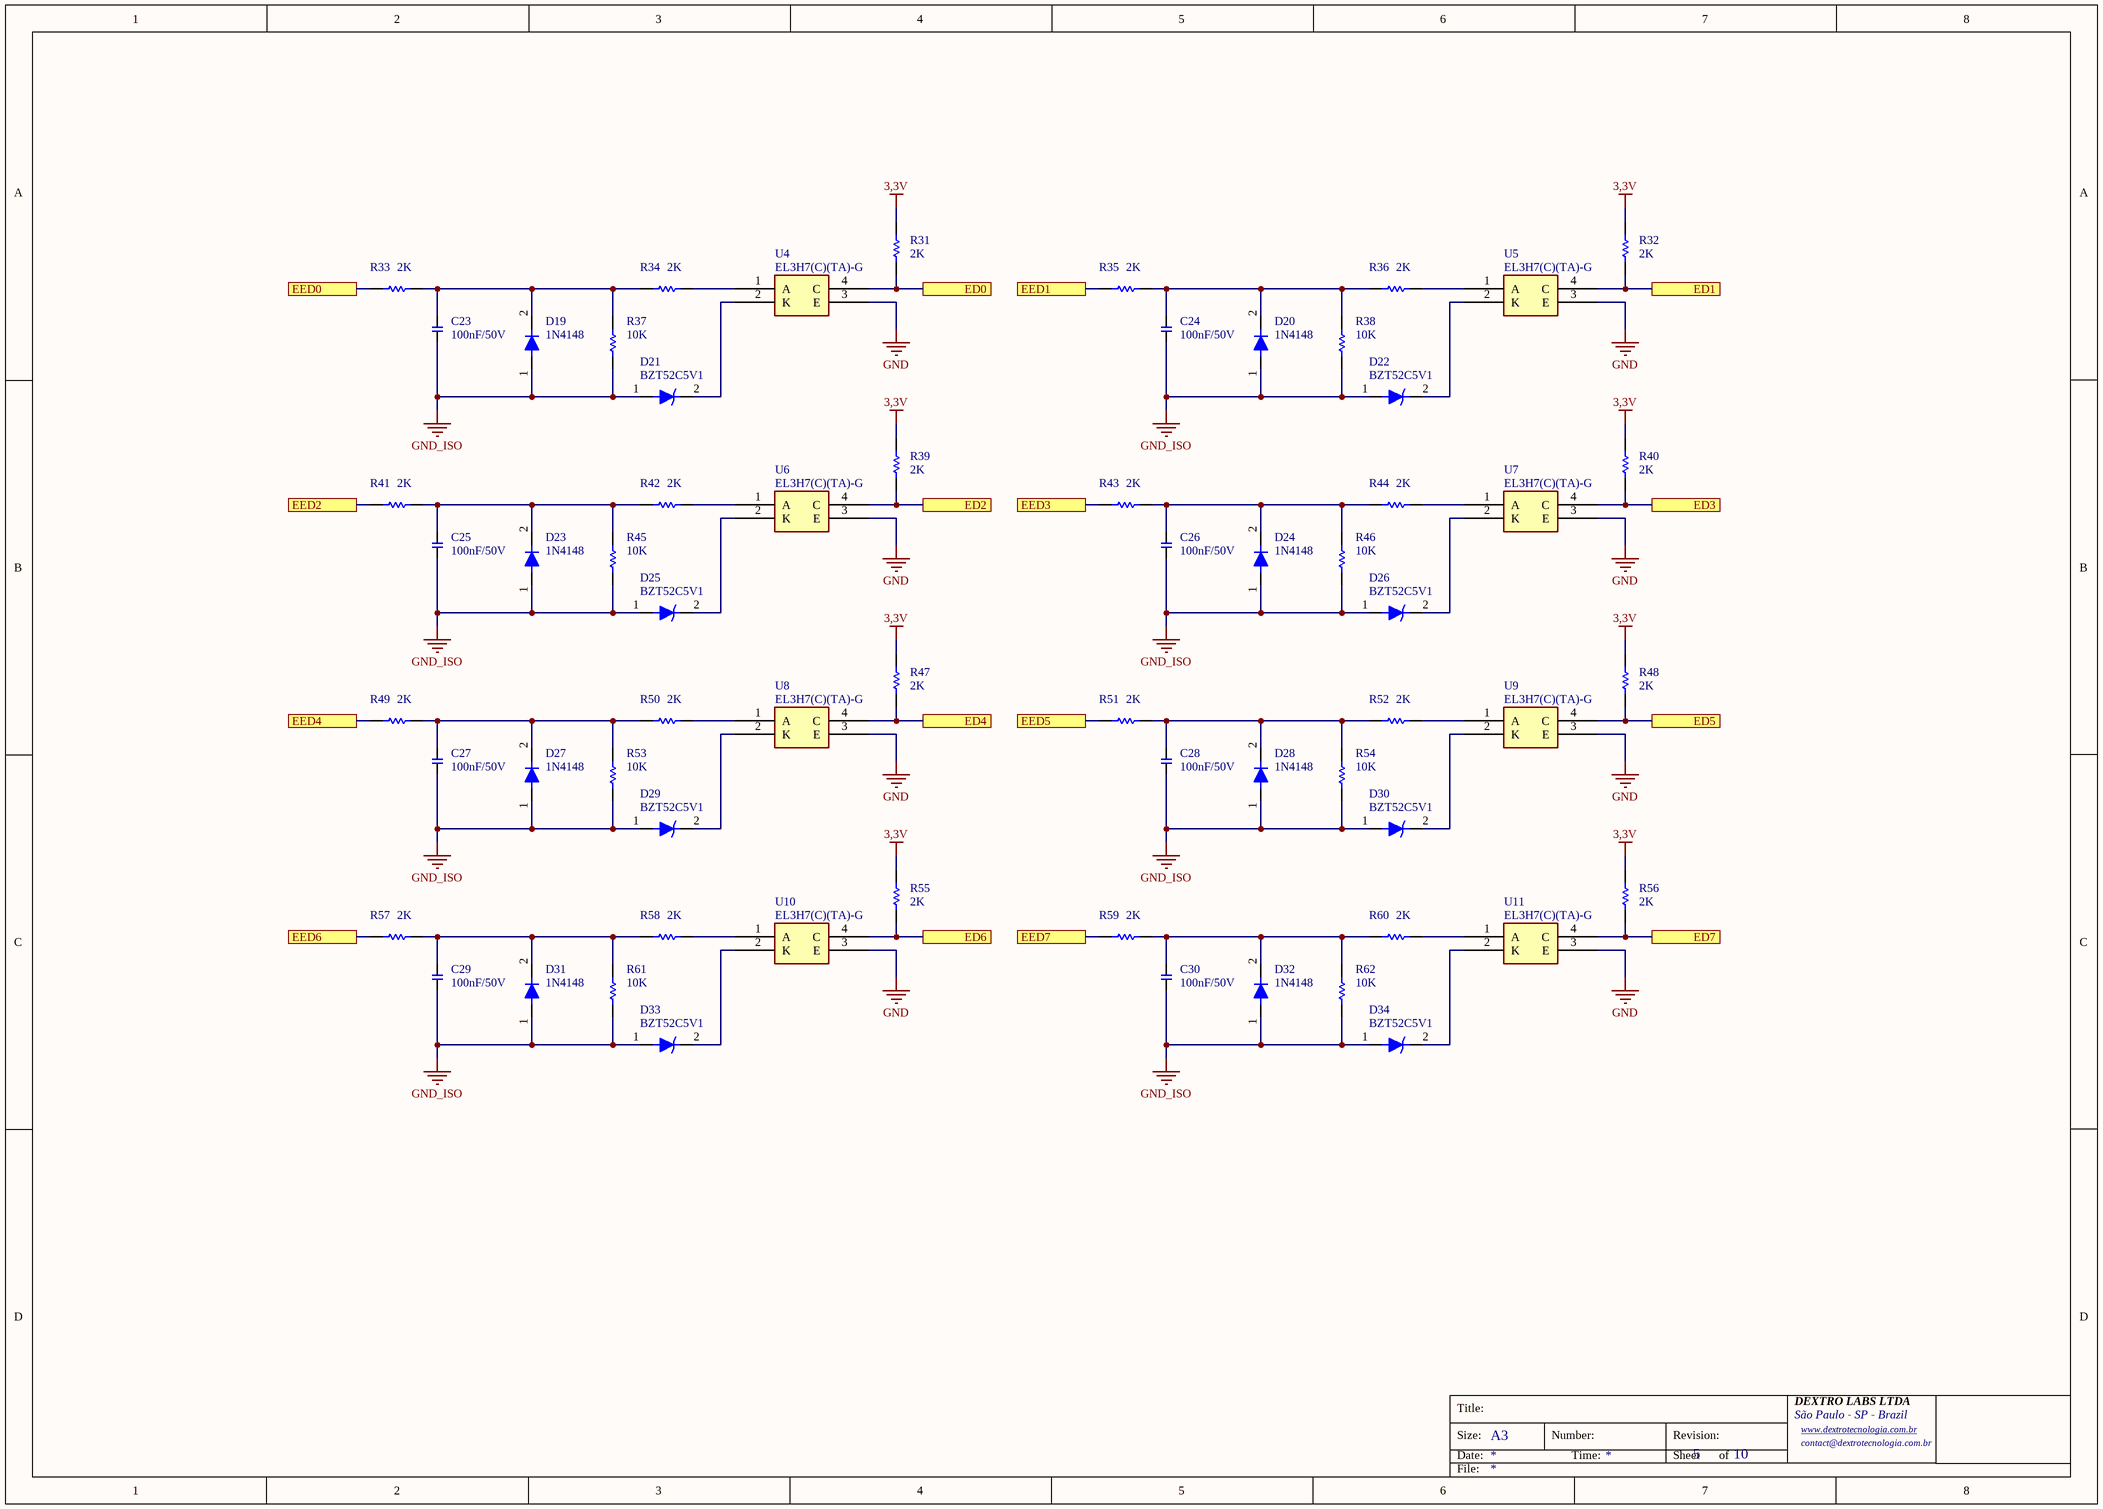
[diagram p4: DXES101B-659637-DIGITAL-INPUTS.SchDoc]

### Parts
C23  100nF/50V  [CAP-0603]
C24  100nF/50V  [CAP-0603]
C25  100nF/50V  [CAP-0603]
C26  100nF/50V  [CAP-0603]
C27  100nF/50V  [CAP-0603]
C28  100nF/50V  [CAP-0603]
C29  100nF/50V  [CAP-0603]
C30  100nF/50V  [CAP-0603]
D19  1N4148  [SOD123]
D20  1N4148  [SOD123]
D21  BZT52C5V1  [SOD123]
D22  BZT52C5V1  [SOD123]
D23  1N4148  [SOD123]
D24  1N4148  [SOD123]
D25  BZT52C5V1  [SOD123]
D26  BZT52C5V1  [SOD123]
D27  1N4148  [SOD123]
D28  1N4148  [SOD123]
D29  BZT52C5V1  [SOD123]
D30  BZT52C5V1  [SOD123]
D31  1N4148  [SOD123]
D32  1N4148  [SOD123]
D33  BZT52C5V1  [SOD123]
D34  BZT52C5V1  [SOD123]
R31  2K  [RES-0603]
R32  2K  [RES-0603]
R33  2K  [RES-1206]
R34  2K  [RES-1206]
R35  2K  [RES-1206]
R36  2K  [RES-1206]
R37  10K  [RES-0603]
R38  10K  [RES-0603]
R39  2K  [RES-0603]
R40  2K  [RES-0603]
R41  2K  [RES-1206]
R42  2K  [RES-1206]
R43  2K  [RES-1206]
R44  2K  [RES-1206]
R45  10K  [RES-0603]
R46  10K  [RES-0603]
R47  2K  [RES-0603]
R48  2K  [RES-0603]
R49  2K  [RES-1206]
R50  2K  [RES-1206]
R51  2K  [RES-1206]
R52  2K  [RES-1206]
R53  10K  [RES-0603]
R54  10K  [RES-0603]
R55  2K  [RES-0603]
R56  2K  [RES-0603]
R57  2K  [RES-1206]
R58  2K  [RES-1206]
R59  2K  [RES-1206]
R60  2K  [RES-1206]
R61  10K  [RES-0603]
R62  10K  [RES-0603]
U4  EL3H7(C)(TA)-G  [SSOP-4]
U5  EL3H7(C)(TA)-G  [SSOP-4]
U6  EL3H7(C)(TA)-G  [SSOP-4]
U7  EL3H7(C)(TA)-G  [SSOP-4]
U8  EL3H7(C)(TA)-G  [SSOP-4]
U9  EL3H7(C)(TA)-G  [SSOP-4]
U10  EL3H7(C)(TA)-G  [SSOP-4]
U11  EL3H7(C)(TA)-G  [SSOP-4]

### Ports
ED0 (see DXES101B-659637-GENERAL[3B], DXES101B-659637-POWER-AND-SIGNALS[2B]), ED1 (see DXES101B-659637-GENERAL[3B], DXES101B-659637-POWER-AND-SIGNALS[3B]), ED2 (see DXES101B-659637-GENERAL[3B], DXES101B-659637-POWER-AND-SIGNALS[2B]), ED3 (see DXES101B-659637-GENERAL[3B], DXES101B-659637-POWER-AND-SIGNALS[3B]), ED4 (see DXES101B-659637-GENERAL[3B], DXES101B-659637-POWER-AND-SIGNALS[2B]), ED5 (see DXES101B-659637-GENERAL[3B], DXES101B-659637-POWER-AND-SIGNALS[3B]), ED6 (see DXES101B-659637-GENERAL[3B], DXES101B-659637-POWER-AND-SIGNALS[2C]), ED7 (see DXES101B-659637-GENERAL[3B], DXES101B-659637-POWER-AND-SIGNALS[3C]), EED0 (see DXES101B-659637-GENERAL[4B]), EED1 (see DXES101B-659637-GENERAL[4B]), EED2 (see DXES101B-659637-GENERAL[4B]), EED3 (see DXES101B-659637-GENERAL[4B]), EED4 (see DXES101B-659637-GENERAL[4B]), EED5 (see DXES101B-659637-GENERAL[4B]), EED6 (see DXES101B-659637-GENERAL[4B]), EED7 (see DXES101B-659637-GENERAL[4B])

### Nets
3,3V: R31.2 R32.2 R39.2 R40.2 R47.2 R48.2 R55.2 R56.2
GND: U4.3(E) U5.3(E) U6.3(E) U7.3(E) U8.3(E) U9.3(E) U10.3(E) U11.3(E)
GND_ISO: C23.1 C24.1 C25.1 C26.1 C27.1 C28.1 C29.1 C30.1 D19.1(A1) D20.1(A1) D21.1(A1) D22.1(A1) D23.1(A1) D24.1(A1) D25.1(A1) D26.1(A1) D27.1(A1) D28.1(A1) D29.1(A1) D30.1(A1) D31.1(A1) D32.1(A1) D33.1(A1) D34.1(A1) R37.1 R38.1 R45.1 R46.1 R53.1 R54.1 R61.1 R62.1
EED0: R33.1 ; port EED0
EED1: R35.1 ; port EED1
EED2: R41.1 ; port EED2
EED3: R43.1 ; port EED3
EED4: R49.1 ; port EED4
EED5: R51.1 ; port EED5
EED6: R57.1 ; port EED6
EED7: R59.1 ; port EED7
NetC23_2: C23.2 D19.2(K) R33.2 R34.1 R37.2
NetC24_2: C24.2 D20.2(K) R35.2 R36.1 R38.2
NetC25_2: C25.2 D23.2(K) R41.2 R42.1 R45.2
NetC26_2: C26.2 D24.2(K) R43.2 R44.1 R46.2
NetC27_2: C27.2 D27.2(K) R49.2 R50.1 R53.2
NetC28_2: C28.2 D28.2(K) R51.2 R52.1 R54.2
NetC29_2: C29.2 D31.2(K) R57.2 R58.1 R61.2
NetC30_2: C30.2 D32.2(K) R59.2 R60.1 R62.2
NetD21_2: D21.2(K) U4.2(K)
NetD22_2: D22.2(K) U5.2(K)
NetD25_2: D25.2(K) U6.2(K)
NetD26_2: D26.2(K) U7.2(K)
NetD29_2: D29.2(K) U8.2(K)
NetD30_2: D30.2(K) U9.2(K)
NetD33_2: D33.2(K) U10.2(K)
NetD34_2: D34.2(K) U11.2(K)
NetK1_1: R31.1 U4.4(C) ; port ED0
NetK1_2: R32.1 U5.4(C) ; port ED1
NetK1_3: R39.1 U6.4(C) ; port ED2
NetK1_4: R40.1 U7.4(C) ; port ED3
NetK1_5: R47.1 U8.4(C) ; port ED4
NetK1_6: R48.1 U9.4(C) ; port ED5
NetK1_7: R55.1 U10.4(C) ; port ED6
NetK1_8: R56.1 U11.4(C) ; port ED7
NetR34_2: R34.2 U4.1(A)
NetR36_2: R36.2 U5.1(A)
NetR42_2: R42.2 U6.1(A)
NetR44_2: R44.2 U7.1(A)
NetR50_2: R50.2 U8.1(A)
NetR52_2: R52.2 U9.1(A)
NetR58_2: R58.2 U10.1(A)
NetR60_2: R60.2 U11.1(A)

### Notes on the sheet
- Title:
- Size:
- Date:
- A3
- Number:
- Time:
- Revision:
- Sheet
- of
- DEXTRO LABS LTDA
- São Paulo - SP - Brazil
- www.dextrotecnologia.com.br <http://www.dextrotecnologia.com.br>
- contact@dextrotecnologia.com.br
- File:

### Library data of the parts
C23-C30 = CAP-100nF/50V-0603-X7R-MLCC: as C5 on sheet DXES101B-659637-POWER-AND-SIGNALS; LCSC: C14663
D19 D20 D23 D24 D27 D28 D31 D32 = 1N4148: as D17 on sheet DXES101B-659637-RELAYS
D21 D22 D25 D26 D29 D30 D33 D34 = BZT52C5V1: DIODE-ZENER-5V1-500mV
R31 R32 R39 R40 R47 R48 R55 R56 = RES-2K-1%-100mW-0603: 100mW Thick Film Resistor 75V ±100ppm/℃ ±2% 1kΩ 0603 Chip Resistor - Surface Mount ROHS; LCSC: C22975
R33-R36 R41-R44 R49-R52 R57-R60 = RES-2K-1%-250mW-1206: as R6 on sheet DXES101B-659637-DIGITAL-OUTPUTS; LCSC: C2907466
R37 R38 R45 R46 R53 R54 R61 R62 = RES-10K-1%-100mW-0603: as R9 on sheet DXES101B-659637-DIGITAL-OUTPUTS; LCSC: C98220
U4-U11 = EL3H7(C)(TA)-G: 80V 3.75kV 50mA 200mV@10mA,1mA 6V 1.2V DC SSOP-4-1.27mm Transistor, Photovoltaic Output Optoisolators ROHS; LCSC: C92243

## Sheet DXES101B-659637-ANALOG-INPUTS.SchDoc
size A3; Organization: Altium Limited; Address1: 3 Minna Close; Address2: Belrose; Address3: NSW 2085; Address4: Australia; SheetNumber: 6; SheetTotal: 10
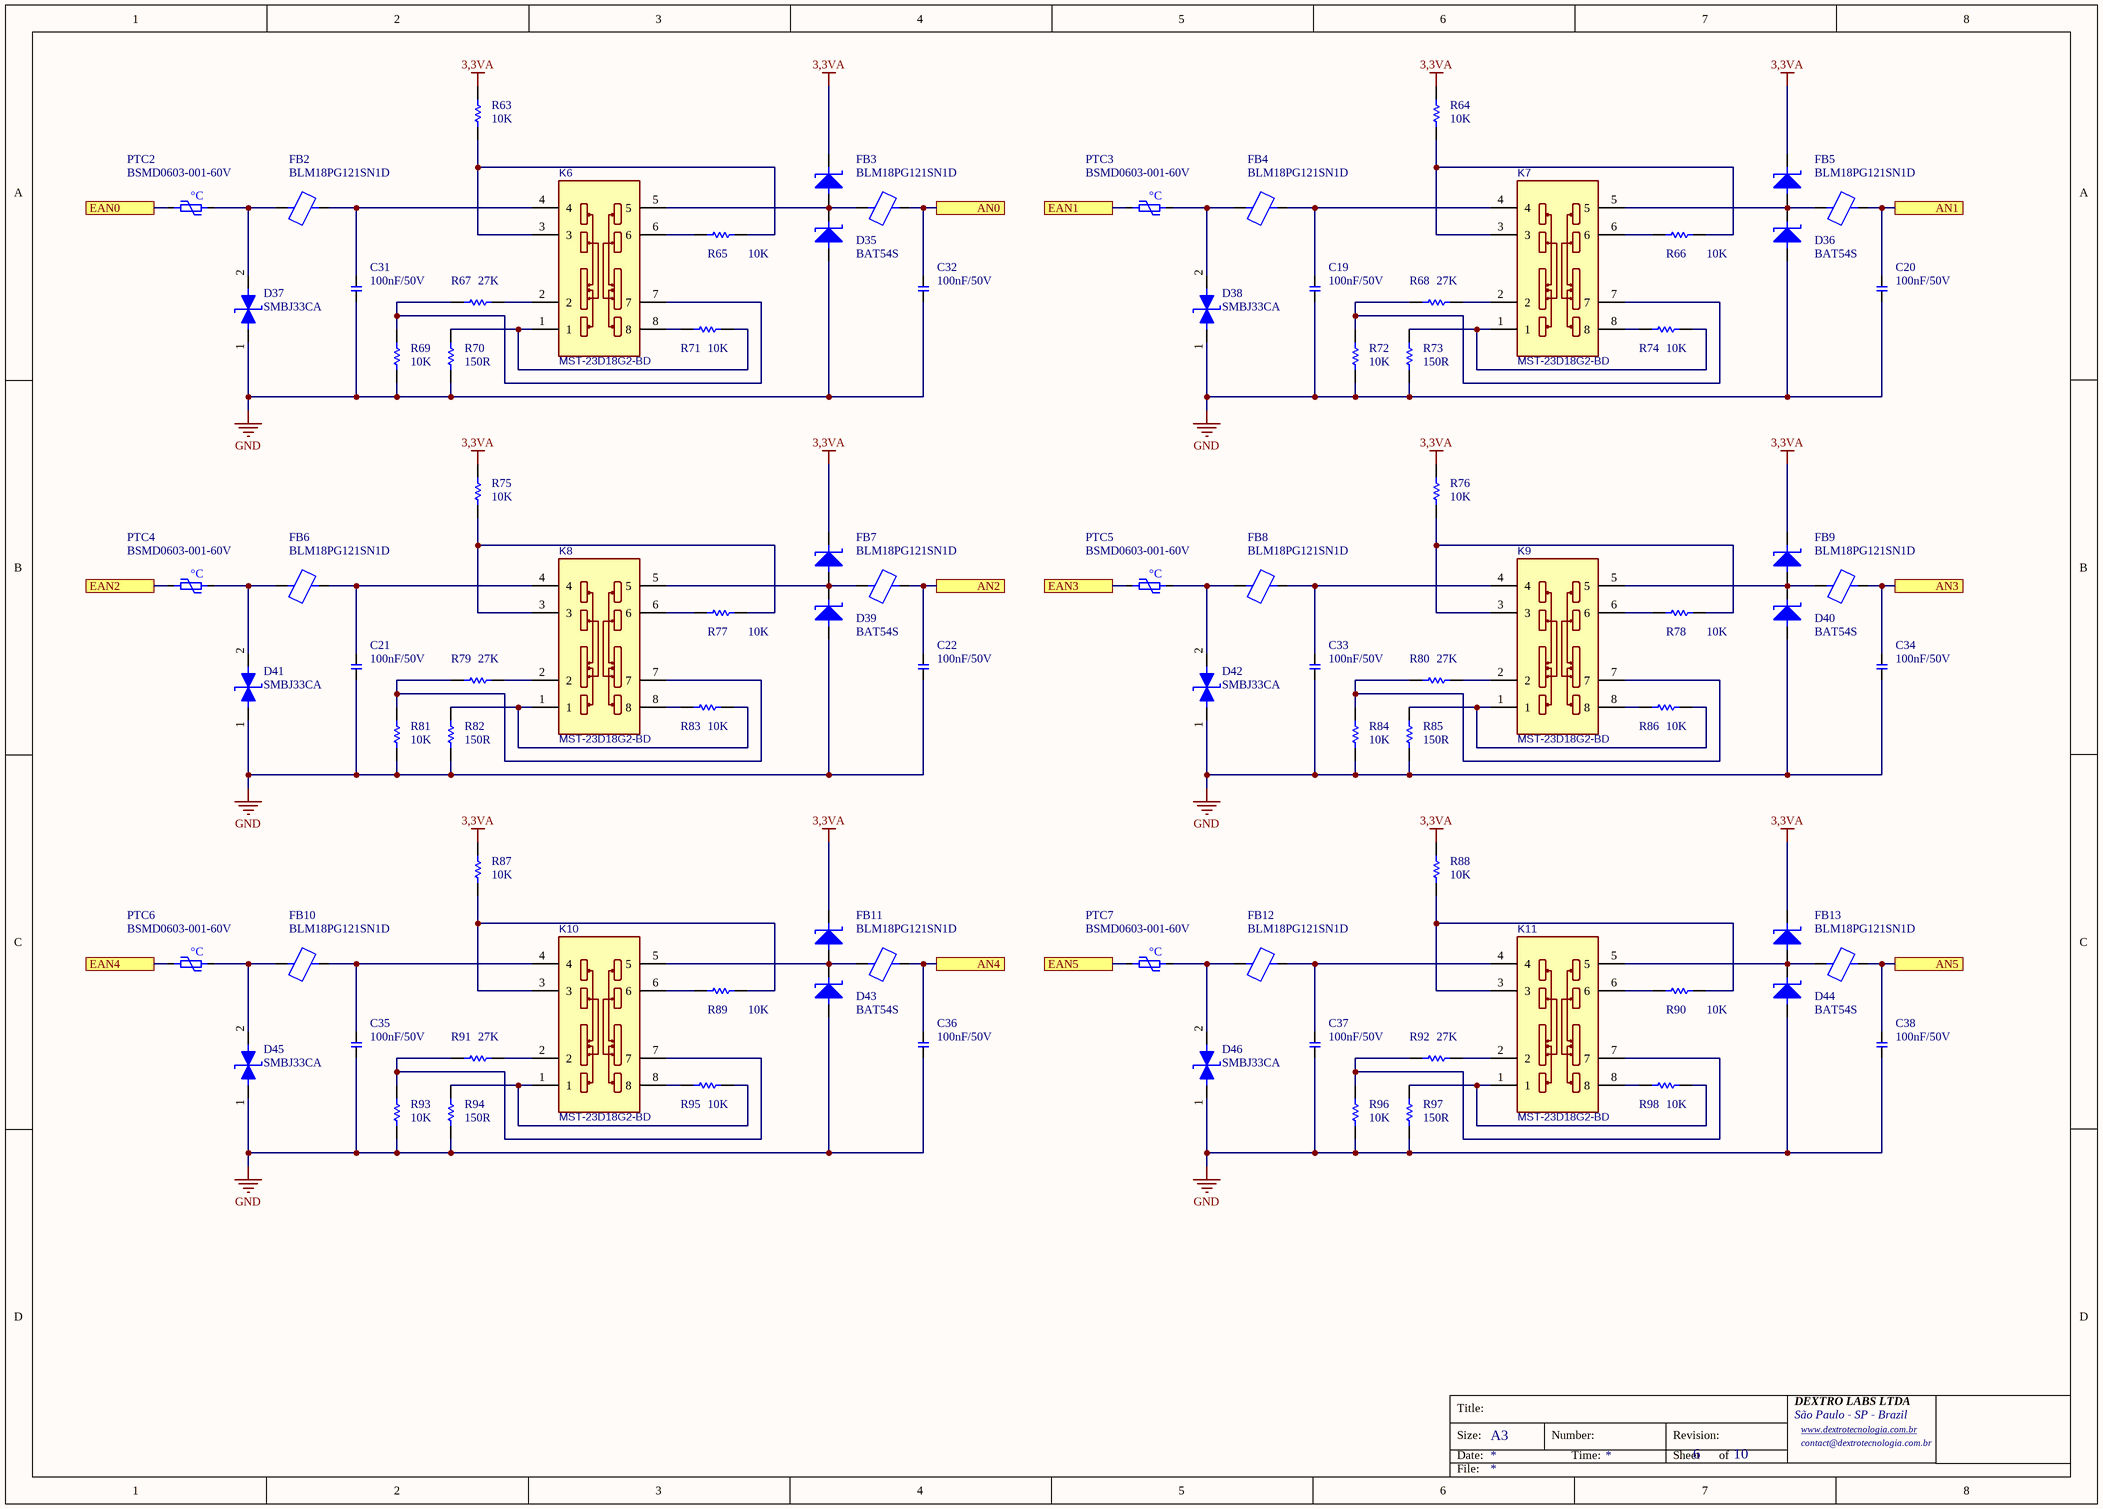
[diagram p5: DXES101B-659637-ANALOG-INPUTS.SchDoc]

### Parts
C19  100nF/50V  [CAP-0603]
C20  100nF/50V  [CAP-0603]
C21  100nF/50V  [CAP-0603]
C22  100nF/50V  [CAP-0603]
C31  100nF/50V  [CAP-0603]
C32  100nF/50V  [CAP-0603]
C33  100nF/50V  [CAP-0603]
C34  100nF/50V  [CAP-0603]
C35  100nF/50V  [CAP-0603]
C36  100nF/50V  [CAP-0603]
C37  100nF/50V  [CAP-0603]
C38  100nF/50V  [CAP-0603]
D35  BAT54S  [SOT23-3]
D36  BAT54S  [SOT23-3]
D37  SMBJ33CA  [DO214-AA]
D38  SMBJ33CA  [DO214-AA]
D39  BAT54S  [SOT23-3]
D40  BAT54S  [SOT23-3]
D41  SMBJ33CA  [DO214-AA]
D42  SMBJ33CA  [DO214-AA]
D43  BAT54S  [SOT23-3]
D44  BAT54S  [SOT23-3]
D45  SMBJ33CA  [DO214-AA]
D46  SMBJ33CA  [DO214-AA]
FB2  BLM18PG121SN1D  [RES-0603]
FB3  BLM18PG121SN1D  [RES-0603]
FB4  BLM18PG121SN1D  [RES-0603]
FB5  BLM18PG121SN1D  [RES-0603]
FB6  BLM18PG121SN1D  [RES-0603]
FB7  BLM18PG121SN1D  [RES-0603]
FB8  BLM18PG121SN1D  [RES-0603]
FB9  BLM18PG121SN1D  [RES-0603]
FB10  BLM18PG121SN1D  [RES-0603]
FB11  BLM18PG121SN1D  [RES-0603]
FB12  BLM18PG121SN1D  [RES-0603]
FB13  BLM18PG121SN1D  [RES-0603]
K6  MST-23D18G2-BD  [SW-SMD_SHOU_MST23D18G2]
K7  MST-23D18G2-BD  [SW-SMD_SHOU_MST23D18G2]
K8  MST-23D18G2-BD  [SW-SMD_SHOU_MST23D18G2]
K9  MST-23D18G2-BD  [SW-SMD_SHOU_MST23D18G2]
K10  MST-23D18G2-BD  [SW-SMD_SHOU_MST23D18G2]
K11  MST-23D18G2-BD  [SW-SMD_SHOU_MST23D18G2]
PTC2  BSMD0603-001-60V  [PTC-0603]
PTC3  BSMD0603-001-60V  [PTC-0603]
PTC4  BSMD0603-001-60V  [PTC-0603]
PTC5  BSMD0603-001-60V  [PTC-0603]
PTC6  BSMD0603-001-60V  [PTC-0603]
PTC7  BSMD0603-001-60V  [PTC-0603]
R63  10K  [RES-0603]
R64  10K  [RES-0603]
R65  10K  [RES-0603]
R66  10K  [RES-0603]
R67  27K  [RES-0603]
R68  27K  [RES-0603]
R69  10K  [RES-0603]
R70  150R  [RES-1210]
R71  10K  [RES-0603]
R72  10K  [RES-0603]
R73  150R  [RES-1210]
R74  10K  [RES-0603]
R75  10K  [RES-0603]
R76  10K  [RES-0603]
R77  10K  [RES-0603]
R78  10K  [RES-0603]
R79  27K  [RES-0603]
R80  27K  [RES-0603]
R81  10K  [RES-0603]
R82  150R  [RES-1210]
R83  10K  [RES-0603]
R84  10K  [RES-0603]
R85  150R  [RES-1210]
R86  10K  [RES-0603]
R87  10K  [RES-0603]
R88  10K  [RES-0603]
R89  10K  [RES-0603]
R90  10K  [RES-0603]
R91  27K  [RES-0603]
R92  27K  [RES-0603]
R93  10K  [RES-0603]
R94  150R  [RES-1210]
R95  10K  [RES-0603]
R96  10K  [RES-0603]
R97  150R  [RES-1210]
R98  10K  [RES-0603]

### Ports
AN0 (see DXES101B-659637-GENERAL[3B], DXES101B-659637-POWER-AND-SIGNALS[4B]), AN1 (see DXES101B-659637-GENERAL[3B], DXES101B-659637-POWER-AND-SIGNALS[5B]), AN2 (see DXES101B-659637-GENERAL[3B], DXES101B-659637-POWER-AND-SIGNALS[4B]), AN3 (see DXES101B-659637-GENERAL[3B], DXES101B-659637-POWER-AND-SIGNALS[5B]), AN4 (see DXES101B-659637-GENERAL[3B], DXES101B-659637-POWER-AND-SIGNALS[4B]), AN5 (see DXES101B-659637-GENERAL[3B], DXES101B-659637-POWER-AND-SIGNALS[5B]), EAN0 (see DXES101B-659637-GENERAL[4B]), EAN1 (see DXES101B-659637-GENERAL[4B]), EAN2 (see DXES101B-659637-GENERAL[4B]), EAN3 (see DXES101B-659637-GENERAL[4B]), EAN4 (see DXES101B-659637-GENERAL[4B]), EAN5 (see DXES101B-659637-GENERAL[4B])

### Nets
3,3VA: D35.2 D36.2 D39.2 D40.2 D43.2 D44.2 R63.2 R64.2 R75.2 R76.2 R87.2 R88.2
GND: C19.1 C20.1 C21.1 C22.1 C31.1 C32.1 C33.1 C34.1 C35.1 C36.1 C37.1 C38.1 D35.1 D36.1 D37.1(A2) D38.1(A2) D39.1 D40.1 D41.1(A2) D42.1(A2) D43.1 D44.1 D45.1(A2) D46.1(A2) R69.2 R70.1 R72.2 R73.1 R81.2 R82.1 R84.2 R85.1 R93.2 R94.1 R96.2 R97.1
ENA0: PTC2.1 ; port EAN0
ENA1: PTC3.1 ; port EAN1
ENA2: PTC4.1 ; port EAN2
ENA3: PTC5.1 ; port EAN3
ENA4: PTC6.1 ; port EAN4
ENA5: PTC7.1 ; port EAN5
NetC19_2: C19.2 FB4.2 K7.4
NetC20_2: C20.2 FB5.2 ; port AN1
NetC21_2: C21.2 FB6.2 K8.4
NetC22_2: C22.2 FB7.2 ; port AN2
NetC31_2: C31.2 FB2.2 K6.4
NetC32_2: C32.2 FB3.2 ; port AN0
NetC33_2: C33.2 FB8.2 K9.4
NetC34_2: C34.2 FB9.2 ; port AN3
NetC35_2: C35.2 FB10.2 K10.4
NetC36_2: C36.2 FB11.2 ; port AN4
NetC37_2: C37.2 FB12.2 K11.4
NetC38_2: C38.2 FB13.2 ; port AN5
NetD35_3: D35.3 FB3.1 K6.5
NetD36_3: D36.3 FB5.1 K7.5
NetD37_2: D37.2(A1) FB2.1 PTC2.2
NetD38_2: D38.2(A1) FB4.1 PTC3.2
NetD39_3: D39.3 FB7.1 K8.5
NetD40_3: D40.3 FB9.1 K9.5
NetD41_2: D41.2(A1) FB6.1 PTC4.2
NetD42_2: D42.2(A1) FB8.1 PTC5.2
NetD43_3: D43.3 FB11.1 K10.5
NetD44_3: D44.3 FB13.1 K11.5
NetD45_2: D45.2(A1) FB10.1 PTC6.2
NetD46_2: D46.2(A1) FB12.1 PTC7.2
NetK6_1: K6.1 R70.2 R71.1
NetK6_2: K6.2 R67.2
NetK6_3: K6.3 R63.1 R65.1
NetK6_6: K6.6 R65.2
NetK6_7: K6.7 R67.1 R69.1
NetK6_8: K6.8 R71.2
NetK7_1: K7.1 R73.2 R74.1
NetK7_2: K7.2 R68.2
NetK7_3: K7.3 R64.1 R66.1
NetK7_6: K7.6 R66.2
NetK7_7: K7.7 R68.1 R72.1
NetK7_8: K7.8 R74.2
NetK8_1: K8.1 R82.2 R83.1
NetK8_2: K8.2 R79.2
NetK8_3: K8.3 R75.1 R77.1
NetK8_6: K8.6 R77.2
NetK8_7: K8.7 R79.1 R81.1
NetK8_8: K8.8 R83.2
NetK9_1: K9.1 R85.2 R86.1
NetK9_2: K9.2 R80.2
NetK9_3: K9.3 R76.1 R78.1
NetK9_6: K9.6 R78.2
NetK9_7: K9.7 R80.1 R84.1
NetK9_8: K9.8 R86.2
NetK10_1: K10.1 R94.2 R95.1
NetK10_2: K10.2 R91.2
NetK10_3: K10.3 R87.1 R89.1
NetK10_6: K10.6 R89.2
NetK10_7: K10.7 R91.1 R93.1
NetK10_8: K10.8 R95.2
NetK11_1: K11.1 R97.2 R98.1
NetK11_2: K11.2 R92.2
NetK11_3: K11.3 R88.1 R90.1
NetK11_6: K11.6 R90.2
NetK11_7: K11.7 R92.1 R96.1
NetK11_8: K11.8 R98.2

### Notes on the sheet
- Title:
- Size:
- Date:
- A3
- Number:
- Time:
- Revision:
- Sheet
- of
- DEXTRO LABS LTDA
- São Paulo - SP - Brazil
- www.dextrotecnologia.com.br <http://www.dextrotecnologia.com.br>
- contact@dextrotecnologia.com.br
- File:
- (in symbol PTC-FUSE-60V-10mA-0603) °C

### Library data of the parts
C19-C22 C31-C38 = CAP-100nF/50V-0603-X7R-MLCC: as C5 on sheet DXES101B-659637-POWER-AND-SIGNALS; LCSC: C14663
D35 D36 D39 D40 D43 D44 = BAT54S: 30V Dual 200mA 800mV@100mA SOT-23 Schottky Barrier Diodes (SBD) ROHS; LCSC: C916425
D37 D38 D41 D42 D45 D46 = SMBJ33CA: as D3 on sheet DXES101B-659637-POWER-AND-SIGNALS; LCSC: C3001986
FB2-FB13 = BLM18PG121SN1D: FERRITE BEAD 120Ω 0603 1LN; LCSC: C14709
K6-K11 = MST-23D18G2-BD: SLIDE-SWITCH-SP3T; Manufacturer: SHOU HAN(首韩); Contributor: lcsc; Supplier: LCSC; Supplier Part: C7507443; Manufacturer Part: MST-23D18G2-BD; JLCPCB Part Class: Extended Part; spicePre: U; spiceSymbolName: MST-23D18G2-BD; LCSC: C7507443
PTC2-PTC7 = PTC-FUSE-60V-10mA-0603: 60V 10mA 20A 50mA 15Ω 0603 PTC Resettable Fuses ROHS; LCSC: C914088
R63-R66 R69 R71 R72 R74-R78 R81 R83 R84 R86-R90 R93 R95 R96 R98 = RES-10K-1%-100mW-0603: as R9 on sheet DXES101B-659637-DIGITAL-OUTPUTS; LCSC: C98220
R67 R68 R79 R80 R91 R92 = RES-27K-1%-100mW-0603: 100mW Thick Film Resistor 75V ±100ppm/℃ ±1% 10kΩ 0603 Chip Resistor - Surface Mount ROHS; LCSC: C98220
R70 R73 R82 R85 R94 R97 = RES-150R-1%-125mW-1210: 500mW 150Ω 200V ±100ppm/℃ Thick Film Resistor ±5% 1210 Chip Resistor - Surface Mount ROHS; LCSC: C620692

## Sheet DXES101B-659637-ANALOG-OUTPUTS.SchDoc
size A3; Organization: Altium Limited; Address1: 3 Minna Close; Address2: Belrose; Address3: NSW 2085; Address4: Australia; SheetNumber: 7; SheetTotal: 10
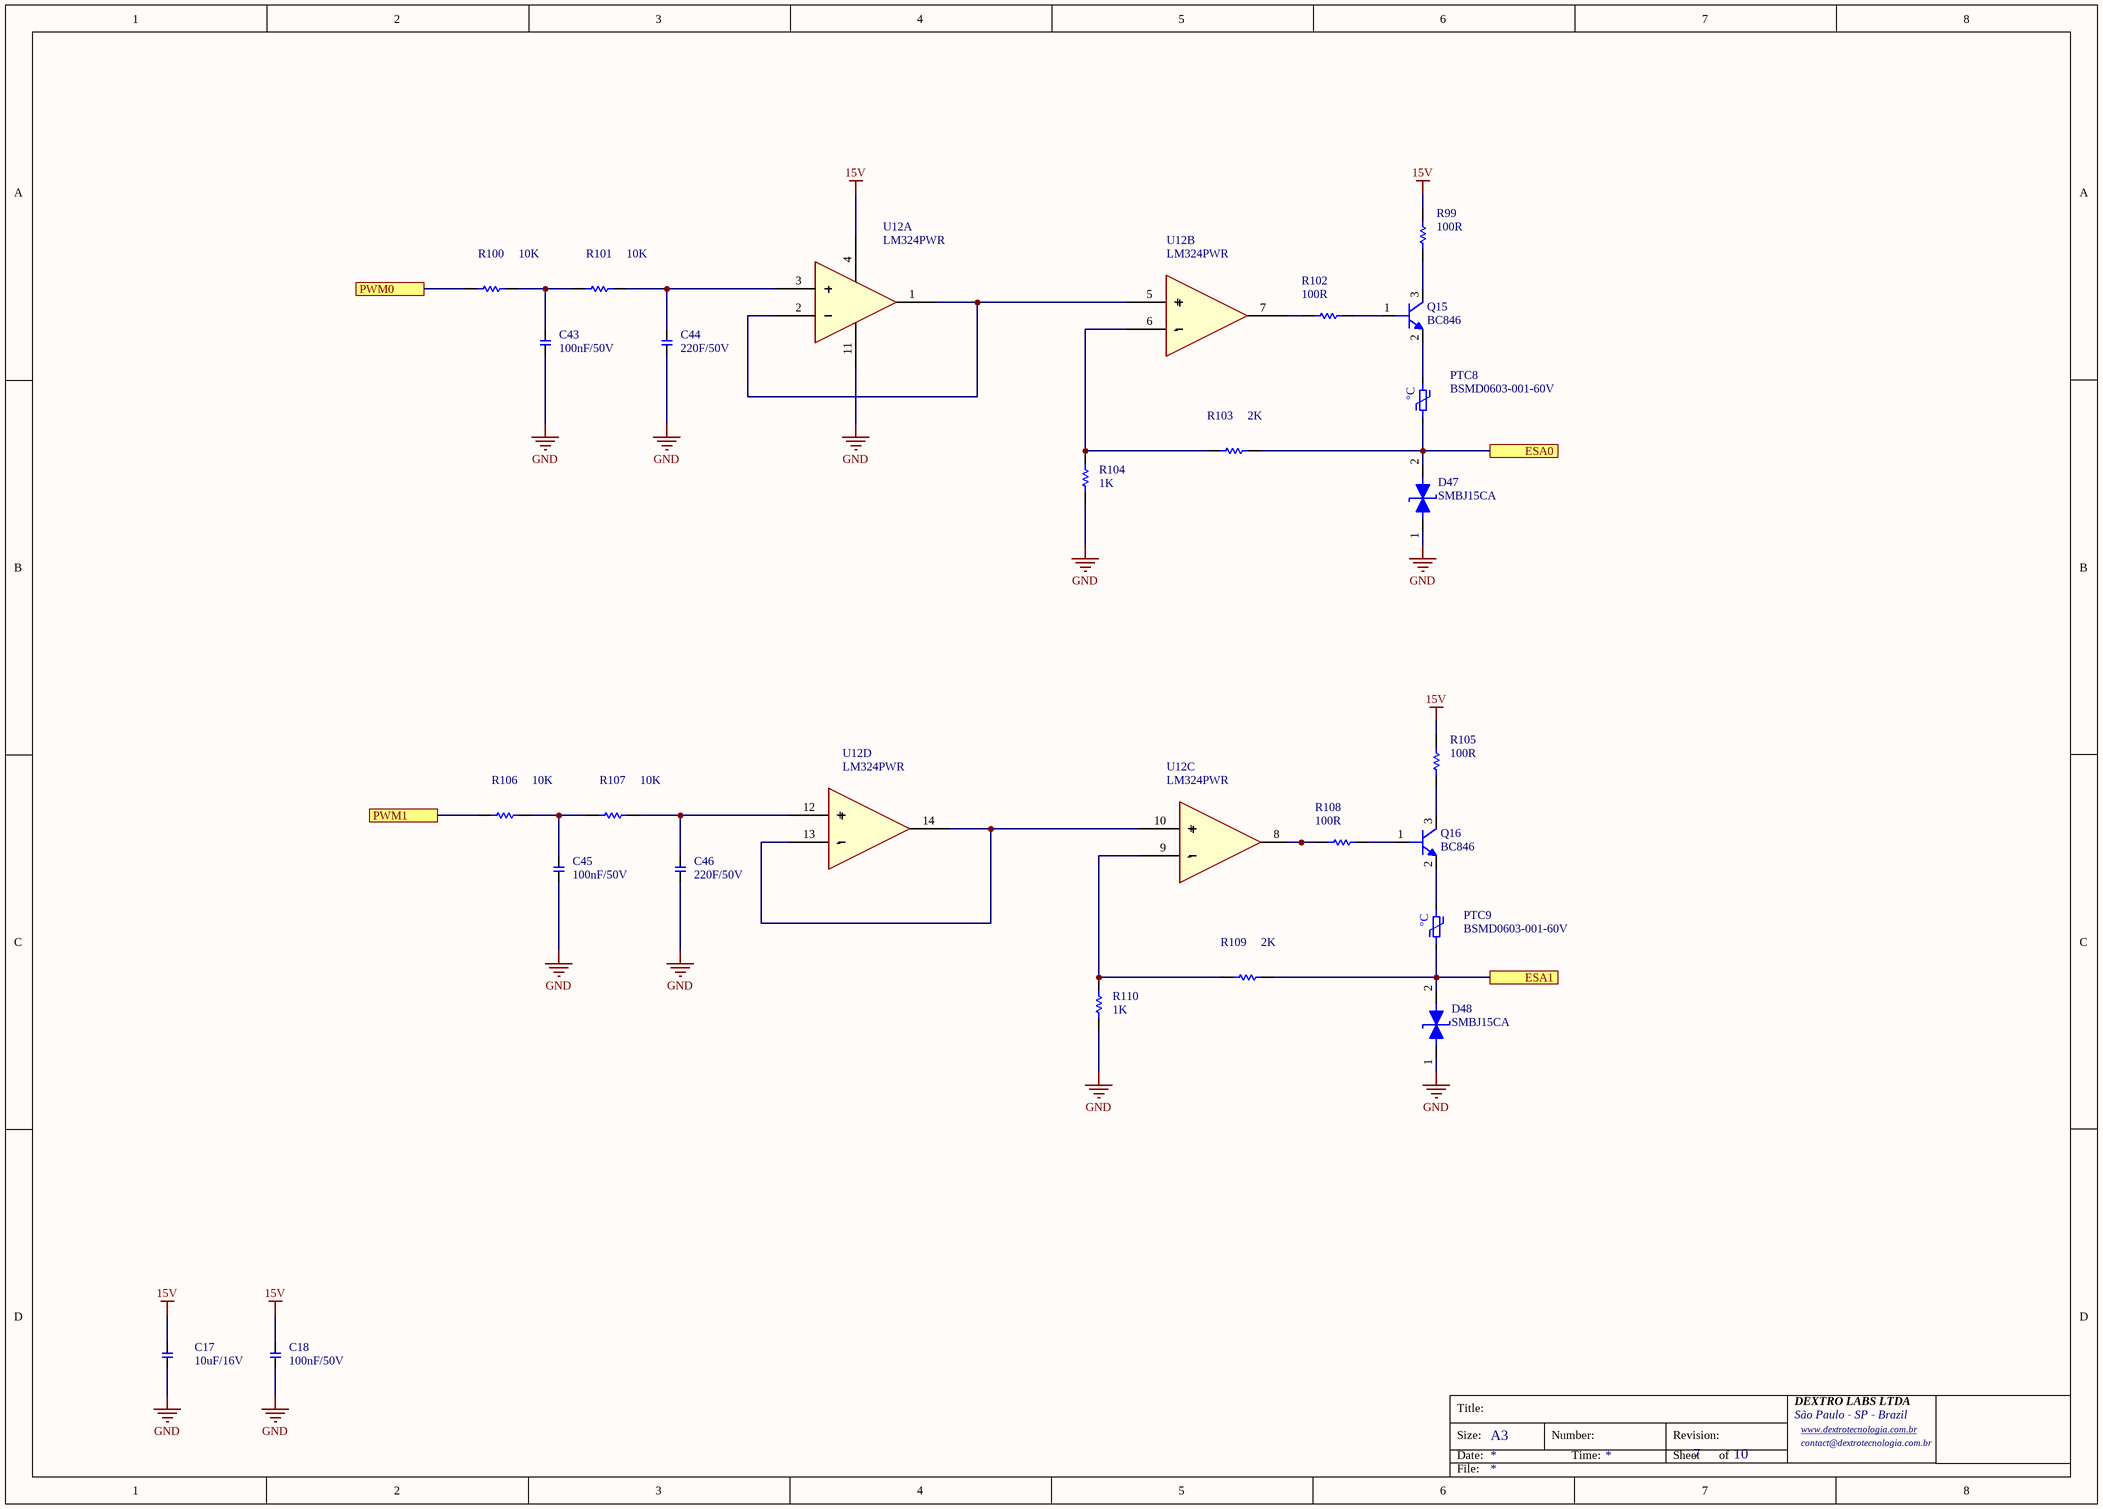
[diagram p6: DXES101B-659637-ANALOG-OUTPUTS.SchDoc]

### Parts
C17  10uF/16V  [CAP-0603]
C18  100nF/50V  [CAP-0603]
C43  100nF/50V  [CAP-0603]
C44  220F/50V  [CAP-0603]
C45  100nF/50V  [CAP-0603]
C46  220F/50V  [CAP-0603]
D47  SMBJ15CA  [DO214-AA]
D48  SMBJ15CA  [DO214-AA]
PTC8  BSMD0603-001-60V  [PTC-0603]
PTC9  BSMD0603-001-60V  [PTC-0603]
Q15  BC846  [SOT23-3]
Q16  BC846  [SOT23-3]
R99  100R  [RES-0603]
R100  10K  [RES-0603]
R101  10K  [RES-0603]
R102  100R  [RES-0603]
R103  2K  [RES-0603]
R104  1K  [RES-0603]
R105  100R  [RES-0603]
R106  10K  [RES-0603]
R107  10K  [RES-0603]
R108  100R  [RES-0603]
R109  2K  [RES-0603]
R110  1K  [RES-0603]
U12  LM324PWR  [TSSOP-14]  (parts A,B,C,D of 4)

### Ports
ESA0 (see DXES101B-659637-GENERAL[4C]), ESA1 (see DXES101B-659637-GENERAL[4C]), PWM0 (see DXES101B-659637-GENERAL[3C], DXES101B-659637-POWER-AND-SIGNALS[5C]), PWM1 (see DXES101B-659637-GENERAL[3C], DXES101B-659637-POWER-AND-SIGNALS[4C])

### Nets
15V: C17.2 C18.2 R99.2 R105.2 U12.4(VCC)
GND: C17.1 C18.1 C43.1 C44.1 C45.1 C46.1 D47.1(A1) D48.1(A1) R104.2 R110.2 U12.11(GND)
ESA0: D47.2(A2) PTC8.1 R103.2 ; port ESA0
ESA1: D48.2(A2) PTC9.1 R109.2 ; port ESA1
NetC43_2: C43.2 R100.2 R101.1
NetC44_2: C44.2 R101.2 U12.3(+)
NetC45_2: C45.2 R106.2 R107.1
NetC46_2: C46.2 R107.2 U12.12(+)
NetK2_9: R106.1 ; port PWM1
NetK2_10: R100.1 ; port PWM0
NetPTC8_2: PTC8.2 Q15.2
NetPTC9_2: PTC9.2 Q16.2
NetQ15_1: Q15.1 R102.2
NetQ15_3: Q15.3 R99.1
NetQ16_1: Q16.1 R108.2
NetQ16_3: Q16.3 R105.1
NetR102_1: R102.1 U12.7
NetR103_1: R103.1 R104.1 U12.6(-)
NetR108_1: R108.1 U12.8
NetR109_1: R109.1 R110.1 U12.9(-)
NetU12_1: U12.1 U12.2(-) U12.5(+)
NetU12_10: U12.10(+) U12.13(-) U12.14

### Notes on the sheet
- Title:
- Size:
- Date:
- A3
- Number:
- Time:
- Revision:
- Sheet
- of
- DEXTRO LABS LTDA
- São Paulo - SP - Brazil
- www.dextrotecnologia.com.br <http://www.dextrotecnologia.com.br>
- contact@dextrotecnologia.com.br
- File:
- (in symbol PTC-FUSE-60V-10mA-0603) °C

### Library data of the parts
C17 = CAP-10uF/16V-0603-X5R: as C3 on sheet DXES101B-659637-POWER-AND-SIGNALS; LCSC: C92487
C18 C43 C45 = CAP-100nF/50V-0603-X7R-MLCC: as C5 on sheet DXES101B-659637-POWER-AND-SIGNALS; LCSC: C14663
C44 C46 = CAP-22nF/50V-0603-X7R-MLCC: 50V 22nF X7R ±10% 0603 Ceramic Capacitors ROHS; LCSC: C1589
D47 D48 = SMBJ15CA: as D1 on sheet DXES101B-659637-POWER-AND-SIGNALS; LCSC: C2760879
PTC8 PTC9 = PTC-FUSE-60V-10mA-0603: as PTC2 on sheet DXES101B-659637-ANALOG-INPUTS; LCSC: C914088
Q15 Q16 = TRANSISTOR-BC846B,215-SOT23: as Q4 on sheet DXES101B-659637-DIGITAL-OUTPUTS; LCSC: C87062
R99 R102 R105 R108 = RES-100R-1%-100mW-0603: 100mW Thick Film Resistor 75V ±100ppm/℃ ±1% 100Ω 0603 Chip Resistor - Surface Mount ROHS; LCSC: C105588
R100 R101 R106 R107 = RES-10K-1%-100mW-0603: as R9 on sheet DXES101B-659637-DIGITAL-OUTPUTS; LCSC: C98220
R103 R109 = RES-2K-1%-100mW-0603: as R31 on sheet DXES101B-659637-DIGITAL-INPUTS; LCSC: C22975
R104 R110 = RES-1K-1%-100mW-0603: as R27 on sheet DXES101B-659637-RELAYS; LCSC: C22548
U12 = LM324PWR: Quad 20nA 0.5V/us 1.2MHz TSSOP-14 Operational Amplifier ROHS; LCSC: C7942

## Sheet DXES101B-659637-COMM-PORTS.SchDoc
size A3; Organization: Altium Limited; Address1: 3 Minna Close; Address2: Belrose; Address3: NSW 2085; Address4: Australia; SheetNumber: 8; SheetTotal: 10
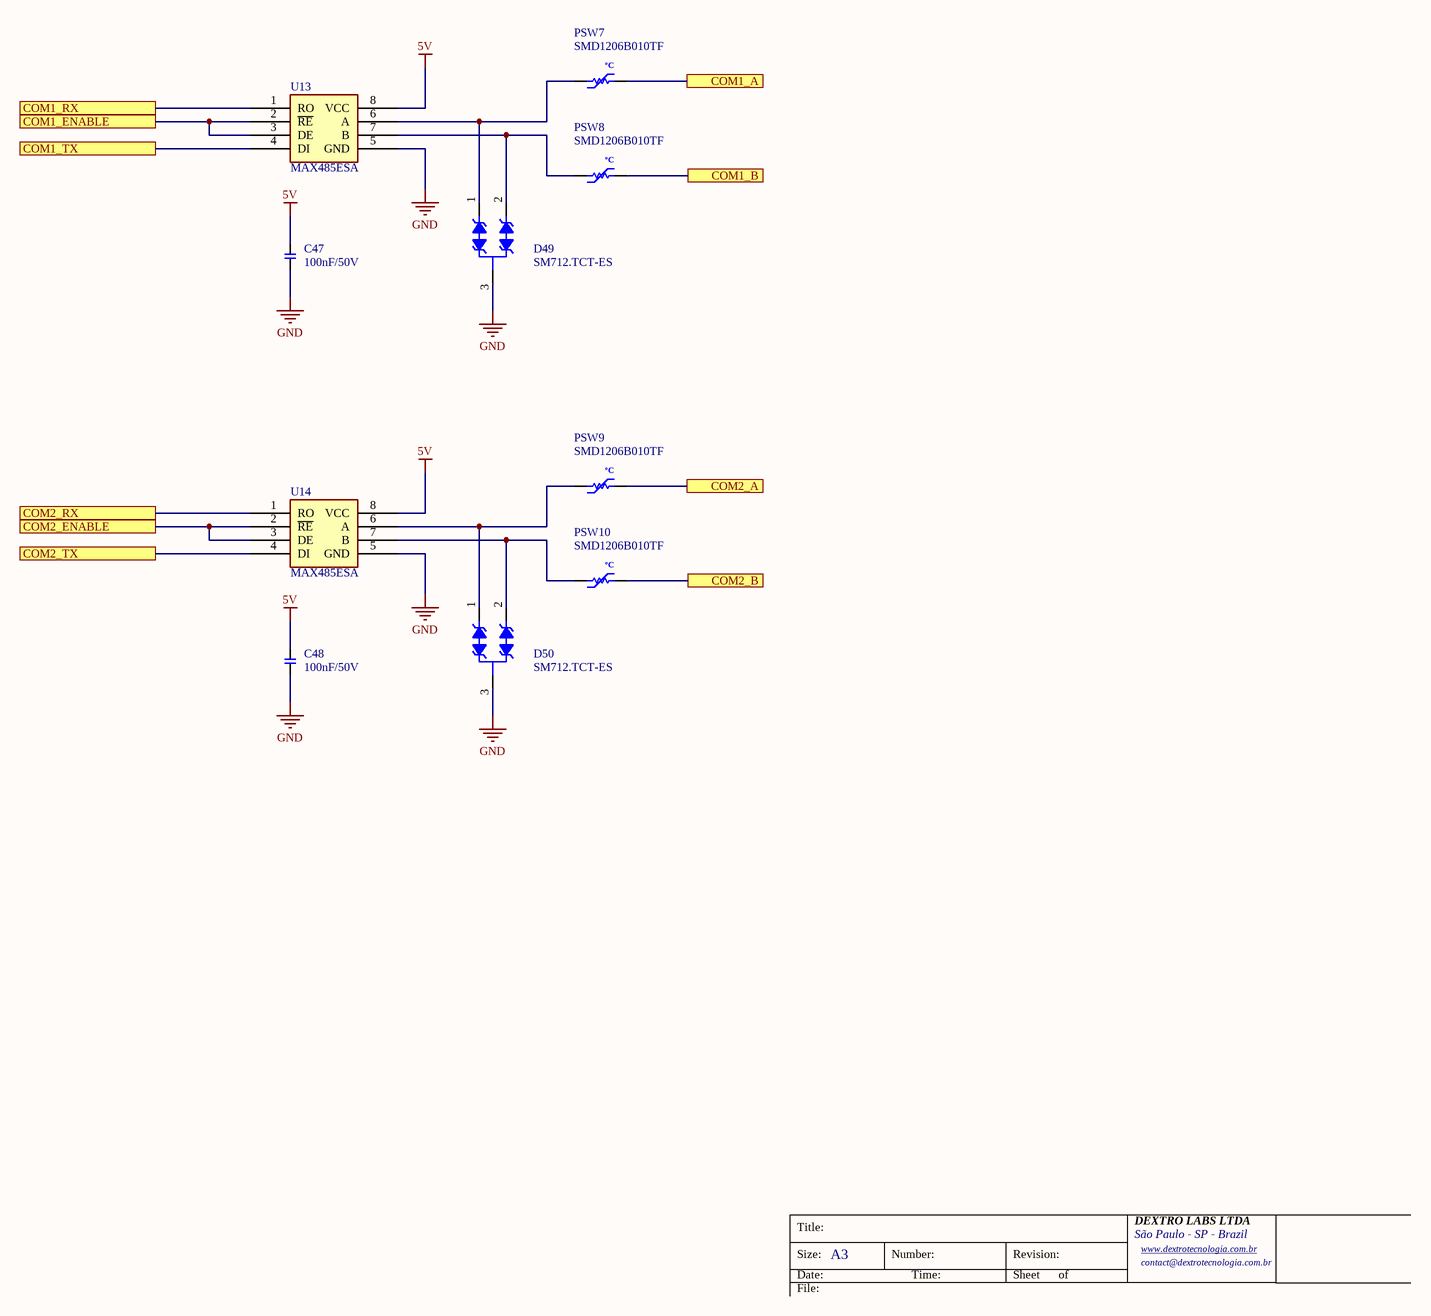
[diagram p7: DXES101B-659637-COMM-PORTS.SchDoc]

### Parts
C47  100nF/50V  [CAP-0603]
C48  100nF/50V  [CAP-0603]
D49  SM712.TCT-ES  [SOT23-3]
D50  SM712.TCT-ES  [SOT23-3]
PSW7  SMD1206B010TF  [RES-1206]
PSW8  SMD1206B010TF  [RES-1206]
PSW9  SMD1206B010TF  [RES-1206]
PSW10  SMD1206B010TF  [RES-1206]
U13  MAX485ESA  [SOIC-08]
U14  MAX485ESA  [SOIC-08]

### Ports
COM1_A (see DXES101B-659637-GENERAL[4C]), COM1_B (see DXES101B-659637-GENERAL[4C]), COM1_ENABLE (see DXES101B-659637-GENERAL[3C], DXES101B-659637-POWER-AND-SIGNALS[2C]), COM1_RX (see DXES101B-659637-GENERAL[3C], DXES101B-659637-POWER-AND-SIGNALS[3C]), COM1_TX (see DXES101B-659637-GENERAL[3C], DXES101B-659637-POWER-AND-SIGNALS[2C]), COM2_A (see DXES101B-659637-GENERAL[4C]), COM2_B (see DXES101B-659637-GENERAL[4C]), COM2_ENABLE (see DXES101B-659637-GENERAL[3C], DXES101B-659637-POWER-AND-SIGNALS[3C]), COM2_RX (see DXES101B-659637-GENERAL[3C], DXES101B-659637-POWER-AND-SIGNALS[3C]), COM2_TX (see DXES101B-659637-GENERAL[3C], DXES101B-659637-POWER-AND-SIGNALS[2C])

### Nets
5V: C47.2 C48.2 U13.8(VCC) U14.8(VCC)
GND: C47.1 C48.1 D49.3(K) D50.3(K) U13.5(GND) U14.5(GND)
COM1_A: PSW7.2 ; port COM1_A
COM1_B: PSW8.2 ; port COM1_B
COM2_A: PSW9.2 ; port COM2_A
COM2_B: PSW10.2 ; port COM2_B
NetD49_1: D49.1(A1) PSW7.1 U13.6(A)
NetD49_2: D49.2(A2) PSW8.1 U13.7(B)
NetD50_1: D50.1(A1) PSW9.1 U14.6(A)
NetD50_2: D50.2(A2) PSW10.1 U14.7(B)
NetK3_1: U13.4(DI) ; port COM1_TX
NetK3_2: U13.1(RO) ; port COM1_RX
NetK3_3: U13.2(~{RE}) U13.3(DE) ; port COM1_ENABLE
NetK3_4: U14.2(~{RE}) U14.3(DE) ; port COM2_ENABLE
NetK3_5: U14.4(DI) ; port COM2_TX
NetK3_6: U14.1(RO) ; port COM2_RX

### Notes on the sheet
- Title:
- Size:
- Date:
- A3
- Number:
- Time:
- Revision:
- Sheet
- of
- DEXTRO LABS LTDA
- São Paulo - SP - Brazil
- www.dextrotecnologia.com.br <http://www.dextrotecnologia.com.br>
- contact@dextrotecnologia.com.br
- File:
- (in symbol SMD1206B010TF) ºC

### Library data of the parts
C47 C48 = CAP-100nF/50V-0603-X7R-MLCC: as C5 on sheet DXES101B-659637-POWER-AND-SIGNALS; LCSC: C14663
D49 D50 = SM712.TCT-ES: 400W@8/20us Bidirectional SOT-23 ESD and Surge Protection (TVS/ESD) ROHS; LCSC: C22363671
PSW7-PSW10 = SMD1206B010TF: 30V 100mA 100A 270mA 1206 Resettable Fuses ROHS; LCSC: C269108
U13 U14 = MAX485ESA: Low-Power, Slew-Rate-Limited RS-485/RS-422 Transceivers; LCSC: C5279041

## Sheet DXES101B-659637-EXPANSION-BUS.SchDoc
size A3; Organization: Altium Limited; Address1: 3 Minna Close; Address2: Belrose; Address3: NSW 2085; Address4: Australia; SheetNumber: 9; SheetTotal: 10
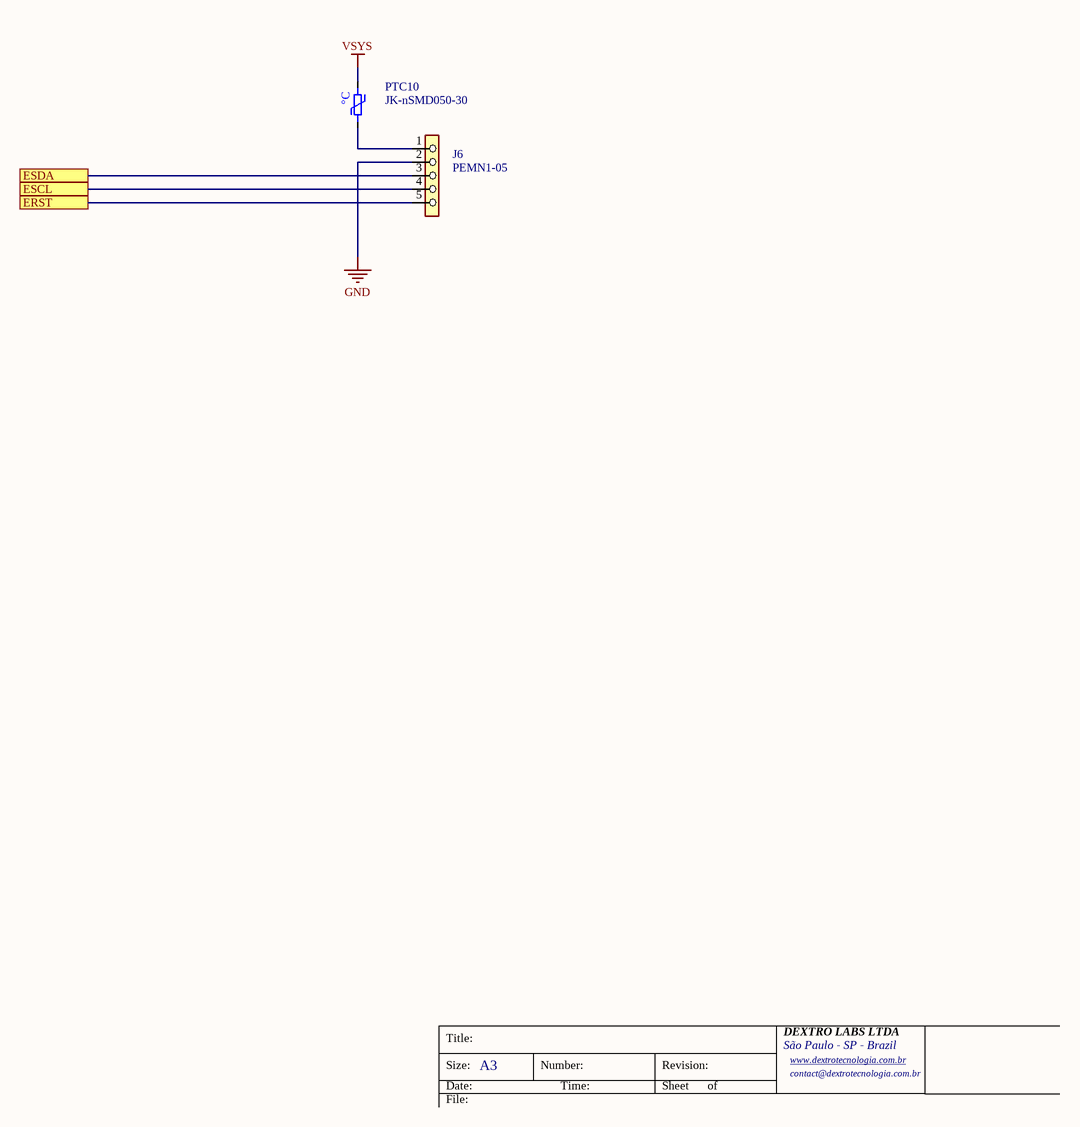
[diagram p8: DXES101B-659637-EXPANSION-BUS.SchDoc]

### Parts
J6  PEMN1-05  [PEMN1-05]
PTC10  JK-nSMD050-30  [PTC-1206]

### Ports
ERST (see DXES101B-659637-GENERAL[3C], DXES101B-659637-POWER-AND-SIGNALS[2C]), ESCL (see DXES101B-659637-GENERAL[3C], DXES101B-659637-POWER-AND-SIGNALS[3C]), ESDA (see DXES101B-659637-GENERAL[3C], DXES101B-659637-POWER-AND-SIGNALS[2C])

### Nets
GND: J6.2
VSYS: PTC10.2
NetJ6_1: J6.1 PTC10.1
NetJ6_3: J6.3 ; port ESDA
NetJ6_4: J6.4 ; port ESCL
NetJ6_5: J6.5 ; port ERST

### Notes on the sheet
- Title:
- Size:
- Date:
- A3
- Number:
- Time:
- Revision:
- Sheet
- of
- DEXTRO LABS LTDA
- São Paulo - SP - Brazil
- www.dextrotecnologia.com.br <http://www.dextrotecnologia.com.br>
- contact@dextrotecnologia.com.br
- File:
- (in symbol PTC-FUSE-30V-500mA-1206) °C

### Library data of the parts
J6 = PEMN1-05: Conector PTH passo 2,5mm - Montagem em placa - 90º - 250VCA - 3A - 10mOhms
PTC10 = PTC-FUSE-30V-500mA-1206: as PTC1 on sheet DXES101B-659637-POWER-AND-SIGNALS; LCSC: C720075

## Sheet DXES101B-659637-MODEM-PORT.SchDoc
size A3; Organization: Altium Limited; Address1: 3 Minna Close; Address2: Belrose; Address3: NSW 2085; Address4: Australia; SheetNumber: 10; SheetTotal: 10
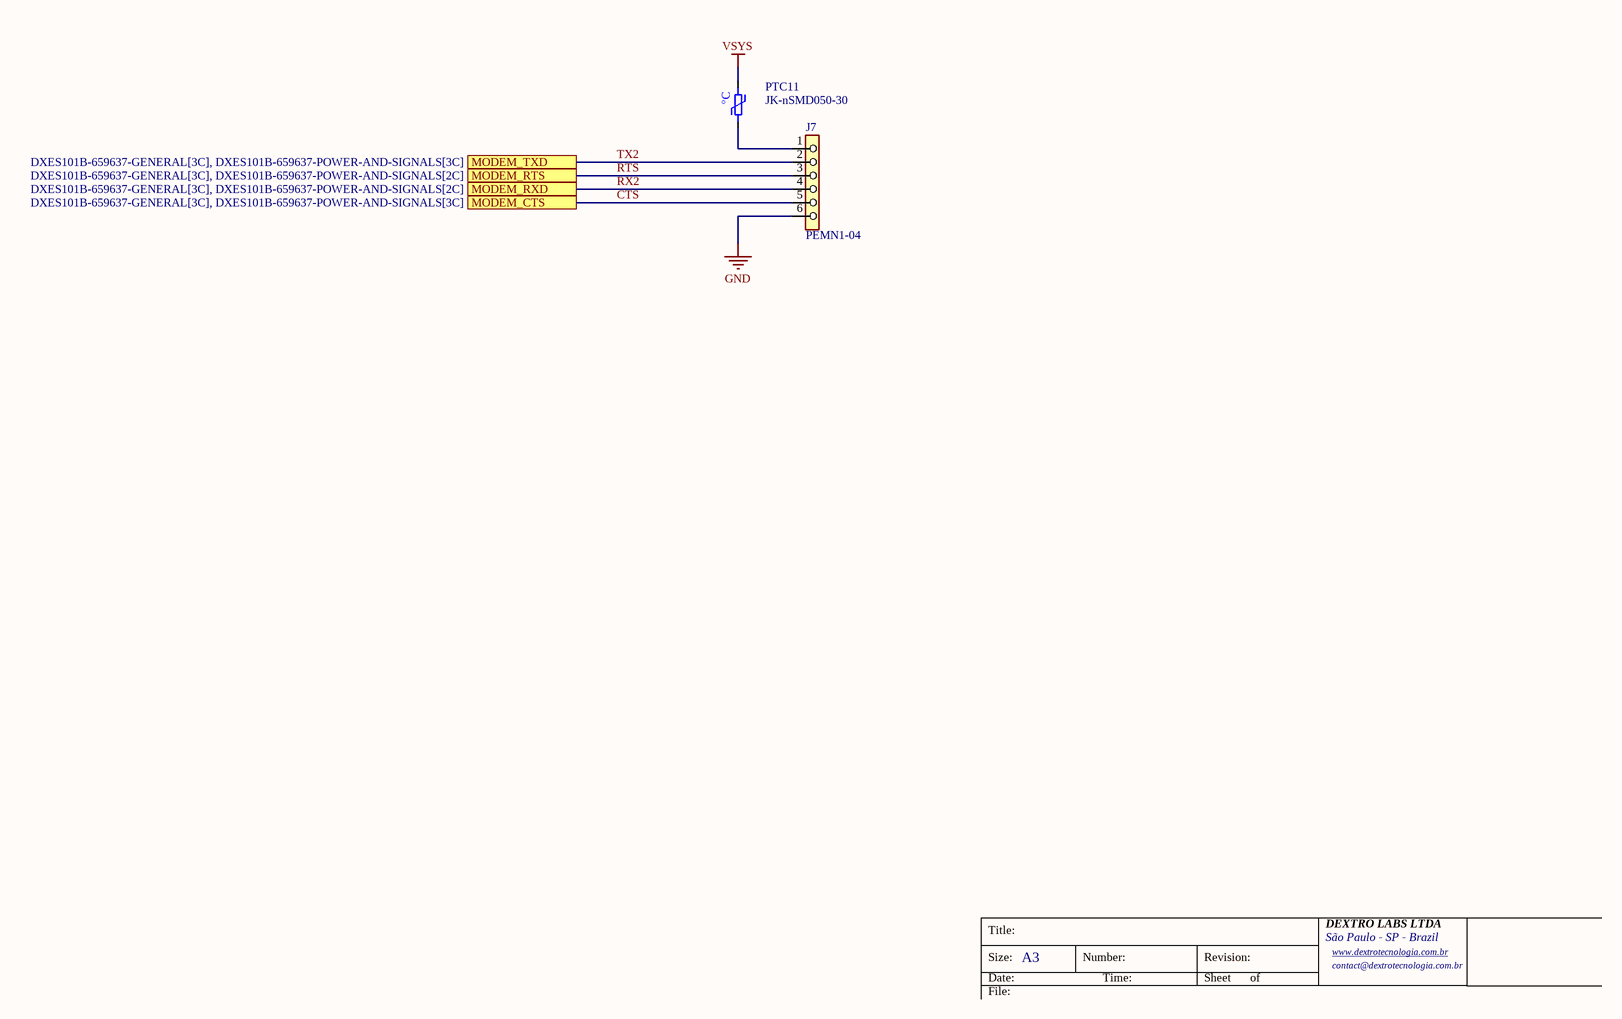
[diagram p9: DXES101B-659637-MODEM-PORT.SchDoc]

### Parts
J7  PEMN1-04  [PEMN1-06]
PTC11  JK-nSMD050-30  [PTC-1206]

### Ports
MODEM_CTS (see DXES101B-659637-GENERAL[3C], DXES101B-659637-POWER-AND-SIGNALS[3C]), MODEM_RTS (see DXES101B-659637-GENERAL[3C], DXES101B-659637-POWER-AND-SIGNALS[2C]), MODEM_RXD (see DXES101B-659637-GENERAL[3C], DXES101B-659637-POWER-AND-SIGNALS[2C]), MODEM_TXD (see DXES101B-659637-GENERAL[3C], DXES101B-659637-POWER-AND-SIGNALS[3C])

### Nets
GND: J7.6
VSYS: PTC11.2
CTS: J7.5 ; port MODEM_CTS
RTS: J7.3 ; port MODEM_RTS
RX2: J7.4 ; port MODEM_RXD
TX2: J7.2 ; port MODEM_TXD
NetJ7_1: J7.1 PTC11.1

### Notes on the sheet
- Title:
- Size:
- Date:
- A3
- Number:
- Time:
- Revision:
- Sheet
- of
- DEXTRO LABS LTDA
- São Paulo - SP - Brazil
- www.dextrotecnologia.com.br <http://www.dextrotecnologia.com.br>
- contact@dextrotecnologia.com.br
- File:
- (in symbol PTC-FUSE-30V-500mA-1206) °C

### Library data of the parts
J7 = PEMN1-06: Conector PTH passo 2,5mm - Montagem em placa - 90º - 250VCA - 3A - 10mOhms
PTC11 = PTC-FUSE-30V-500mA-1206: as PTC1 on sheet DXES101B-659637-POWER-AND-SIGNALS; LCSC: C720075

## Nets that join several sheets
3,3V: DXES101B-659637-POWER-AND-SIGNALS (6 pins), DXES101B-659637-DIGITAL-INPUTS (8 pins)
3,3VA: DXES101B-659637-POWER-AND-SIGNALS (C14.2 C15.2 C16.2 FB1.2), DXES101B-659637-ANALOG-INPUTS (12 pins)
5V: DXES101B-659637-POWER-AND-SIGNALS (11 pins), DXES101B-659637-COMM-PORTS (C47.2 C48.2 U13.8 U14.8)
15V: DXES101B-659637-POWER-AND-SIGNALS (5 pins), DXES101B-659637-ANALOG-OUTPUTS (5 pins)
GND: DXES101B-659637-GENERAL (J1.1 J1.4 J3.2), DXES101B-659637-POWER-AND-SIGNALS (27 pins), DXES101B-659637-DIGITAL-OUTPUTS (18 pins), DXES101B-659637-RELAYS (Q13.2 Q14.2 R28.2 R30.2), DXES101B-659637-DIGITAL-INPUTS (8 pins), DXES101B-659637-ANALOG-INPUTS (36 pins), DXES101B-659637-ANALOG-OUTPUTS (11 pins), DXES101B-659637-COMM-PORTS (6 pins), DXES101B-659637-EXPANSION-BUS (J6.2), DXES101B-659637-MODEM-PORT (J7.6)
GND_ISO: DXES101B-659637-GENERAL (J2.1 J2.2), DXES101B-659637-DIGITAL-INPUTS (32 pins)
VSYS: DXES101B-659637-POWER-AND-SIGNALS (7 pins), DXES101B-659637-DIGITAL-OUTPUTS (18 pins), DXES101B-659637-RELAYS (D17.2 D18.2 K4.1 K5.1), DXES101B-659637-EXPANSION-BUS (PTC10.2), DXES101B-659637-MODEM-PORT (PTC11.2)
VSYSIN: DXES101B-659637-GENERAL (J3.1), DXES101B-659637-POWER-AND-SIGNALS (PTC1.1)
CM0: DXES101B-659637-GENERAL (J5.2), DXES101B-659637-RELAYS (K4.3)
CM1: DXES101B-659637-GENERAL (J5.5), DXES101B-659637-RELAYS (K5.3)
COM1_A: DXES101B-659637-GENERAL (J4.7), DXES101B-659637-COMM-PORTS (PSW7.2)
COM1_B: DXES101B-659637-GENERAL (J4.8), DXES101B-659637-COMM-PORTS (PSW8.2)
COM2_A: DXES101B-659637-GENERAL (J4.9), DXES101B-659637-COMM-PORTS (PSW9.2)
COM2_B: DXES101B-659637-GENERAL (J4.10), DXES101B-659637-COMM-PORTS (PSW10.2)
CTS: DXES101B-659637-POWER-AND-SIGNALS (K1.12), DXES101B-659637-MODEM-PORT (J7.5)
EED0: DXES101B-659637-GENERAL (J2.10), DXES101B-659637-DIGITAL-INPUTS (R33.1)
EED1: DXES101B-659637-GENERAL (J2.9), DXES101B-659637-DIGITAL-INPUTS (R35.1)
EED2: DXES101B-659637-GENERAL (J2.8), DXES101B-659637-DIGITAL-INPUTS (R41.1)
EED3: DXES101B-659637-GENERAL (J2.7), DXES101B-659637-DIGITAL-INPUTS (R43.1)
EED4: DXES101B-659637-GENERAL (J2.6), DXES101B-659637-DIGITAL-INPUTS (R49.1)
EED5: DXES101B-659637-GENERAL (J2.5), DXES101B-659637-DIGITAL-INPUTS (R51.1)
EED6: DXES101B-659637-GENERAL (J2.4), DXES101B-659637-DIGITAL-INPUTS (R57.1)
EED7: DXES101B-659637-GENERAL (J2.3), DXES101B-659637-DIGITAL-INPUTS (R59.1)
ENA0: DXES101B-659637-GENERAL (J1.10), DXES101B-659637-ANALOG-INPUTS (PTC2.1)
ENA1: DXES101B-659637-GENERAL (J1.9), DXES101B-659637-ANALOG-INPUTS (PTC3.1)
ENA2: DXES101B-659637-GENERAL (J1.8), DXES101B-659637-ANALOG-INPUTS (PTC4.1)
ENA3: DXES101B-659637-GENERAL (J1.7), DXES101B-659637-ANALOG-INPUTS (PTC5.1)
ENA4: DXES101B-659637-GENERAL (J1.6), DXES101B-659637-ANALOG-INPUTS (PTC6.1)
ENA5: DXES101B-659637-GENERAL (J1.5), DXES101B-659637-ANALOG-INPUTS (PTC7.1)
ESA0: DXES101B-659637-GENERAL (J1.3), DXES101B-659637-ANALOG-OUTPUTS (D47.2 PTC8.1 R103.2)
ESA1: DXES101B-659637-GENERAL (J1.2), DXES101B-659637-ANALOG-OUTPUTS (D48.2 PTC9.1 R109.2)
ESD0: DXES101B-659637-GENERAL (J4.1), DXES101B-659637-DIGITAL-OUTPUTS (PSW1.2)
ESD1: DXES101B-659637-GENERAL (J4.2), DXES101B-659637-DIGITAL-OUTPUTS (PSW2.2)
ESD2: DXES101B-659637-GENERAL (J4.3), DXES101B-659637-DIGITAL-OUTPUTS (PSW3.2)
ESD3: DXES101B-659637-GENERAL (J4.4), DXES101B-659637-DIGITAL-OUTPUTS (PSW4.2)
ESD4: DXES101B-659637-GENERAL (J4.5), DXES101B-659637-DIGITAL-OUTPUTS (PSW5.2)
ESD5: DXES101B-659637-GENERAL (J4.6), DXES101B-659637-DIGITAL-OUTPUTS (PSW6.2)
NC0: DXES101B-659637-GENERAL (J5.3), DXES101B-659637-RELAYS (K4.5)
NC1: DXES101B-659637-GENERAL (J5.6), DXES101B-659637-RELAYS (K5.5)
NetC20_2: DXES101B-659637-POWER-AND-SIGNALS (K2.2), DXES101B-659637-ANALOG-INPUTS (C20.2 FB5.2)
NetC22_2: DXES101B-659637-POWER-AND-SIGNALS (K2.3), DXES101B-659637-ANALOG-INPUTS (C22.2 FB7.2)
NetC32_2: DXES101B-659637-POWER-AND-SIGNALS (K2.1), DXES101B-659637-ANALOG-INPUTS (C32.2 FB3.2)
NetC34_2: DXES101B-659637-POWER-AND-SIGNALS (K2.4), DXES101B-659637-ANALOG-INPUTS (C34.2 FB9.2)
NetC36_2: DXES101B-659637-POWER-AND-SIGNALS (K2.5), DXES101B-659637-ANALOG-INPUTS (C36.2 FB11.2)
NetC38_2: DXES101B-659637-POWER-AND-SIGNALS (K2.6), DXES101B-659637-ANALOG-INPUTS (C38.2 FB13.2)
NetJ6_3: DXES101B-659637-POWER-AND-SIGNALS (K3.7), DXES101B-659637-EXPANSION-BUS (J6.3)
NetJ6_4: DXES101B-659637-POWER-AND-SIGNALS (K3.8), DXES101B-659637-EXPANSION-BUS (J6.4)
NetJ6_5: DXES101B-659637-POWER-AND-SIGNALS (K1.14), DXES101B-659637-EXPANSION-BUS (J6.5)
NetK1_1: DXES101B-659637-POWER-AND-SIGNALS (K1.1), DXES101B-659637-DIGITAL-INPUTS (R31.1 U4.4)
NetK1_2: DXES101B-659637-POWER-AND-SIGNALS (K1.2), DXES101B-659637-DIGITAL-INPUTS (R32.1 U5.4)
NetK1_3: DXES101B-659637-POWER-AND-SIGNALS (K1.3), DXES101B-659637-DIGITAL-INPUTS (R39.1 U6.4)
NetK1_4: DXES101B-659637-POWER-AND-SIGNALS (K1.4), DXES101B-659637-DIGITAL-INPUTS (R40.1 U7.4)
NetK1_5: DXES101B-659637-POWER-AND-SIGNALS (K1.5), DXES101B-659637-DIGITAL-INPUTS (R47.1 U8.4)
NetK1_6: DXES101B-659637-POWER-AND-SIGNALS (K1.6), DXES101B-659637-DIGITAL-INPUTS (R48.1 U9.4)
NetK1_7: DXES101B-659637-POWER-AND-SIGNALS (K1.7), DXES101B-659637-DIGITAL-INPUTS (R55.1 U10.4)
NetK1_8: DXES101B-659637-POWER-AND-SIGNALS (K1.8), DXES101B-659637-DIGITAL-INPUTS (R56.1 U11.4)
NetK1_15: DXES101B-659637-POWER-AND-SIGNALS (K1.15), DXES101B-659637-RELAYS (R27.1)
NetK1_16: DXES101B-659637-POWER-AND-SIGNALS (K1.16), DXES101B-659637-RELAYS (R29.1)
NetK2_9: DXES101B-659637-POWER-AND-SIGNALS (K2.9), DXES101B-659637-ANALOG-OUTPUTS (R106.1)
NetK2_10: DXES101B-659637-POWER-AND-SIGNALS (K2.10), DXES101B-659637-ANALOG-OUTPUTS (R100.1)
NetK3_1: DXES101B-659637-POWER-AND-SIGNALS (K3.1), DXES101B-659637-COMM-PORTS (U13.4)
NetK3_2: DXES101B-659637-POWER-AND-SIGNALS (K3.2), DXES101B-659637-COMM-PORTS (U13.1)
NetK3_3: DXES101B-659637-POWER-AND-SIGNALS (K3.3), DXES101B-659637-COMM-PORTS (U13.2 U13.3)
NetK3_4: DXES101B-659637-POWER-AND-SIGNALS (K3.4), DXES101B-659637-COMM-PORTS (U14.2 U14.3)
NetK3_5: DXES101B-659637-POWER-AND-SIGNALS (K3.5), DXES101B-659637-COMM-PORTS (U14.4)
NetK3_6: DXES101B-659637-POWER-AND-SIGNALS (K3.6), DXES101B-659637-COMM-PORTS (U14.1)
NetK3_9: DXES101B-659637-POWER-AND-SIGNALS (K3.9), DXES101B-659637-DIGITAL-OUTPUTS (R9.2)
NetK3_10: DXES101B-659637-POWER-AND-SIGNALS (K3.10), DXES101B-659637-DIGITAL-OUTPUTS (R10.2)
NetK3_11: DXES101B-659637-POWER-AND-SIGNALS (K3.11), DXES101B-659637-DIGITAL-OUTPUTS (R11.2)
NetK3_12: DXES101B-659637-POWER-AND-SIGNALS (K3.12), DXES101B-659637-DIGITAL-OUTPUTS (R21.2)
NetK3_13: DXES101B-659637-POWER-AND-SIGNALS (K3.13), DXES101B-659637-DIGITAL-OUTPUTS (R22.2)
NetK3_14: DXES101B-659637-POWER-AND-SIGNALS (K3.14), DXES101B-659637-DIGITAL-OUTPUTS (R23.2)
NO0: DXES101B-659637-GENERAL (J5.1), DXES101B-659637-RELAYS (K4.4)
NO1: DXES101B-659637-GENERAL (J5.4), DXES101B-659637-RELAYS (K5.4)
RTS: DXES101B-659637-POWER-AND-SIGNALS (K1.11), DXES101B-659637-MODEM-PORT (J7.3)
RX2: DXES101B-659637-POWER-AND-SIGNALS (K1.9), DXES101B-659637-MODEM-PORT (J7.4)
TX2: DXES101B-659637-POWER-AND-SIGNALS (K1.10), DXES101B-659637-MODEM-PORT (J7.2)